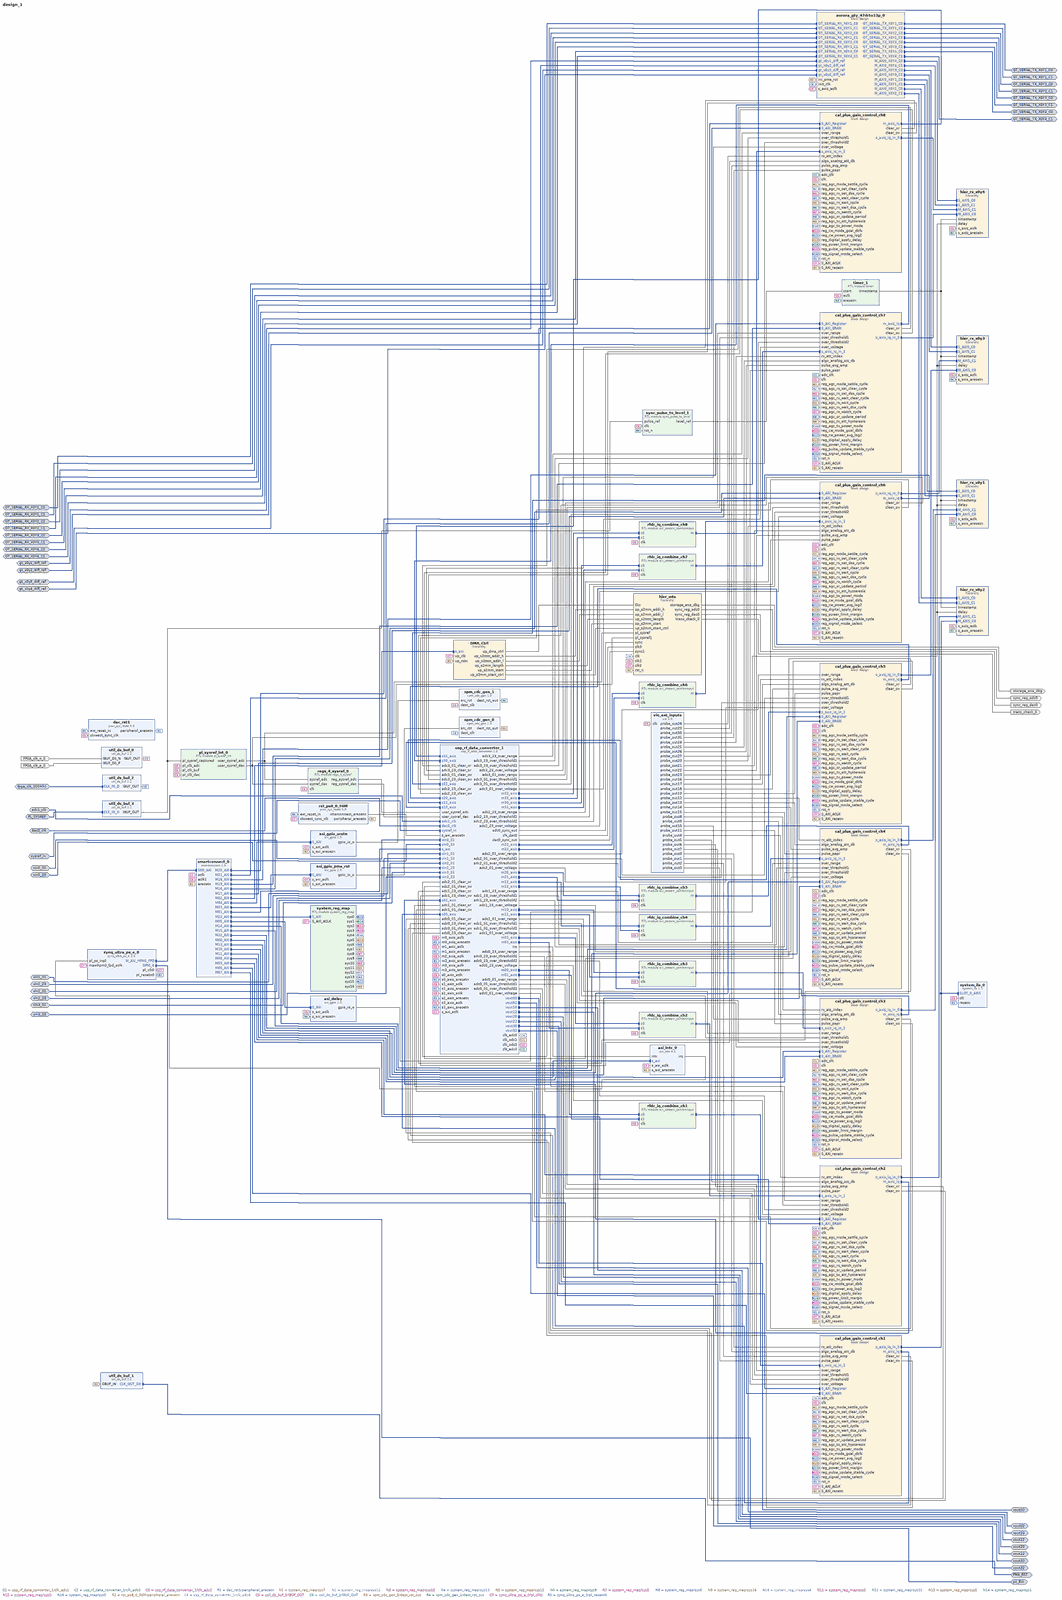
[diagram p0: block diagram of the top level, whole]
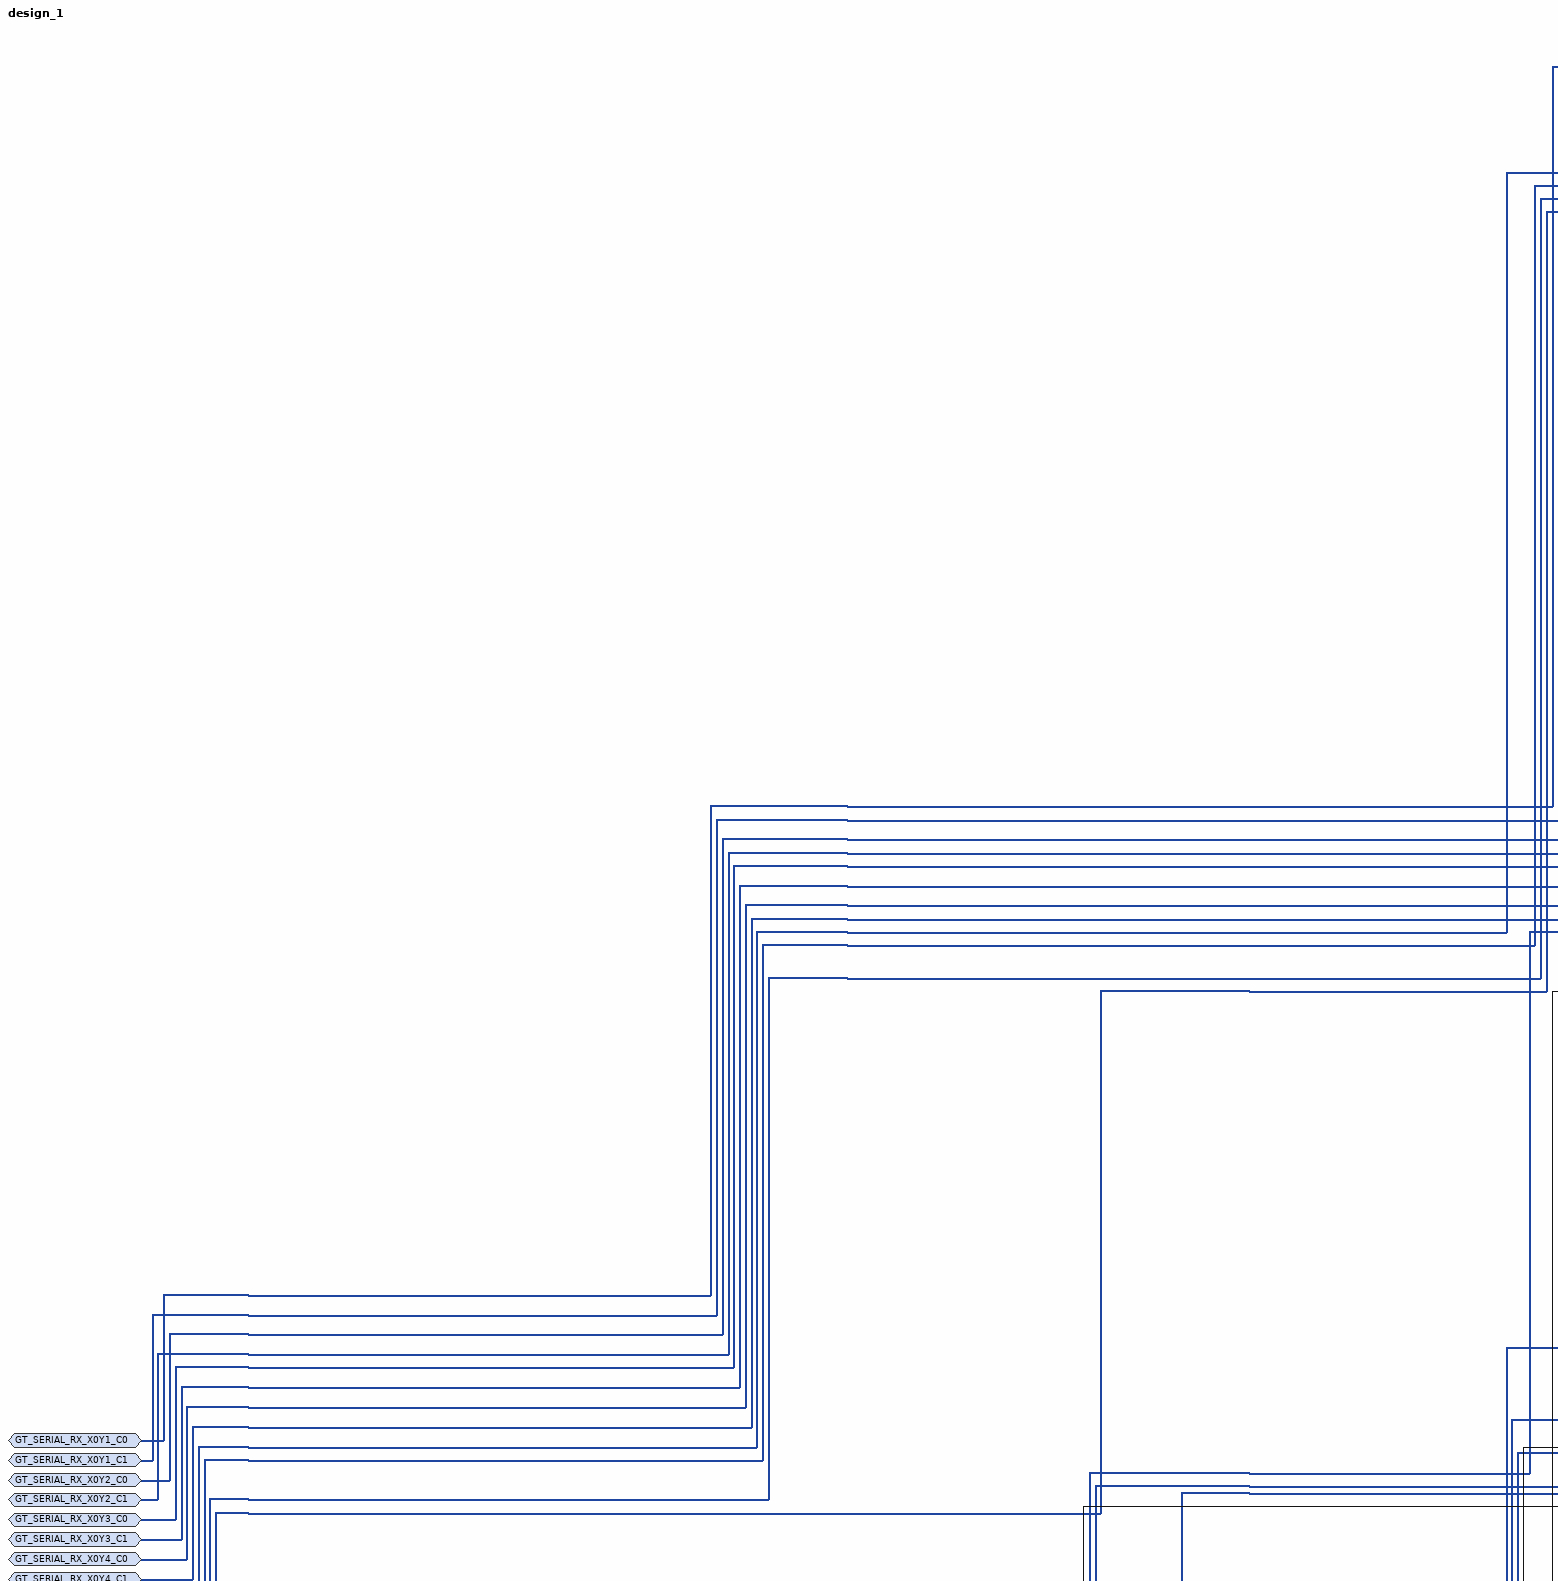
[diagram p1: block diagram of the top level, upper left part]
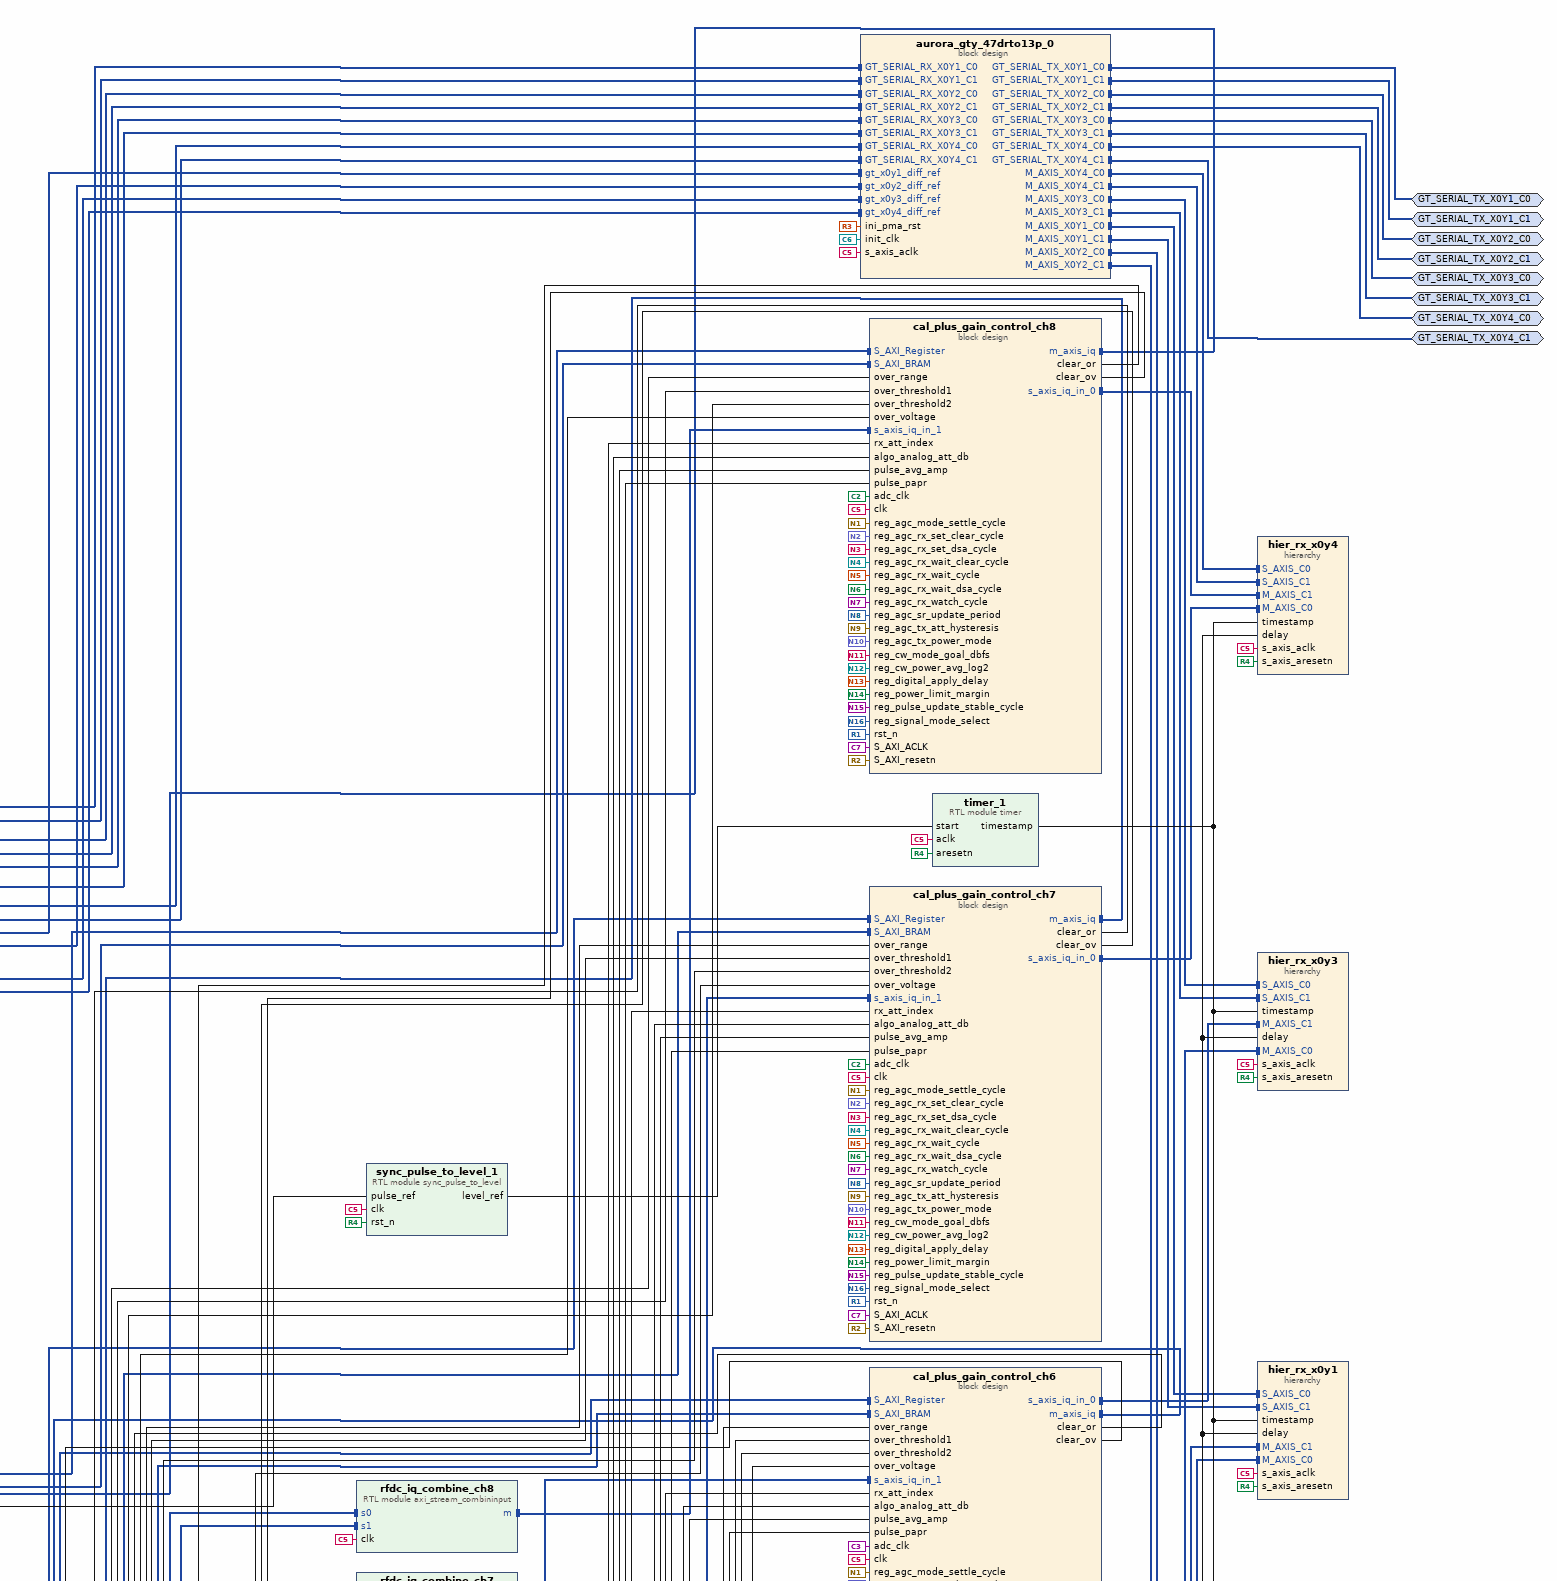
[diagram p2: block diagram of the top level, upper right part]
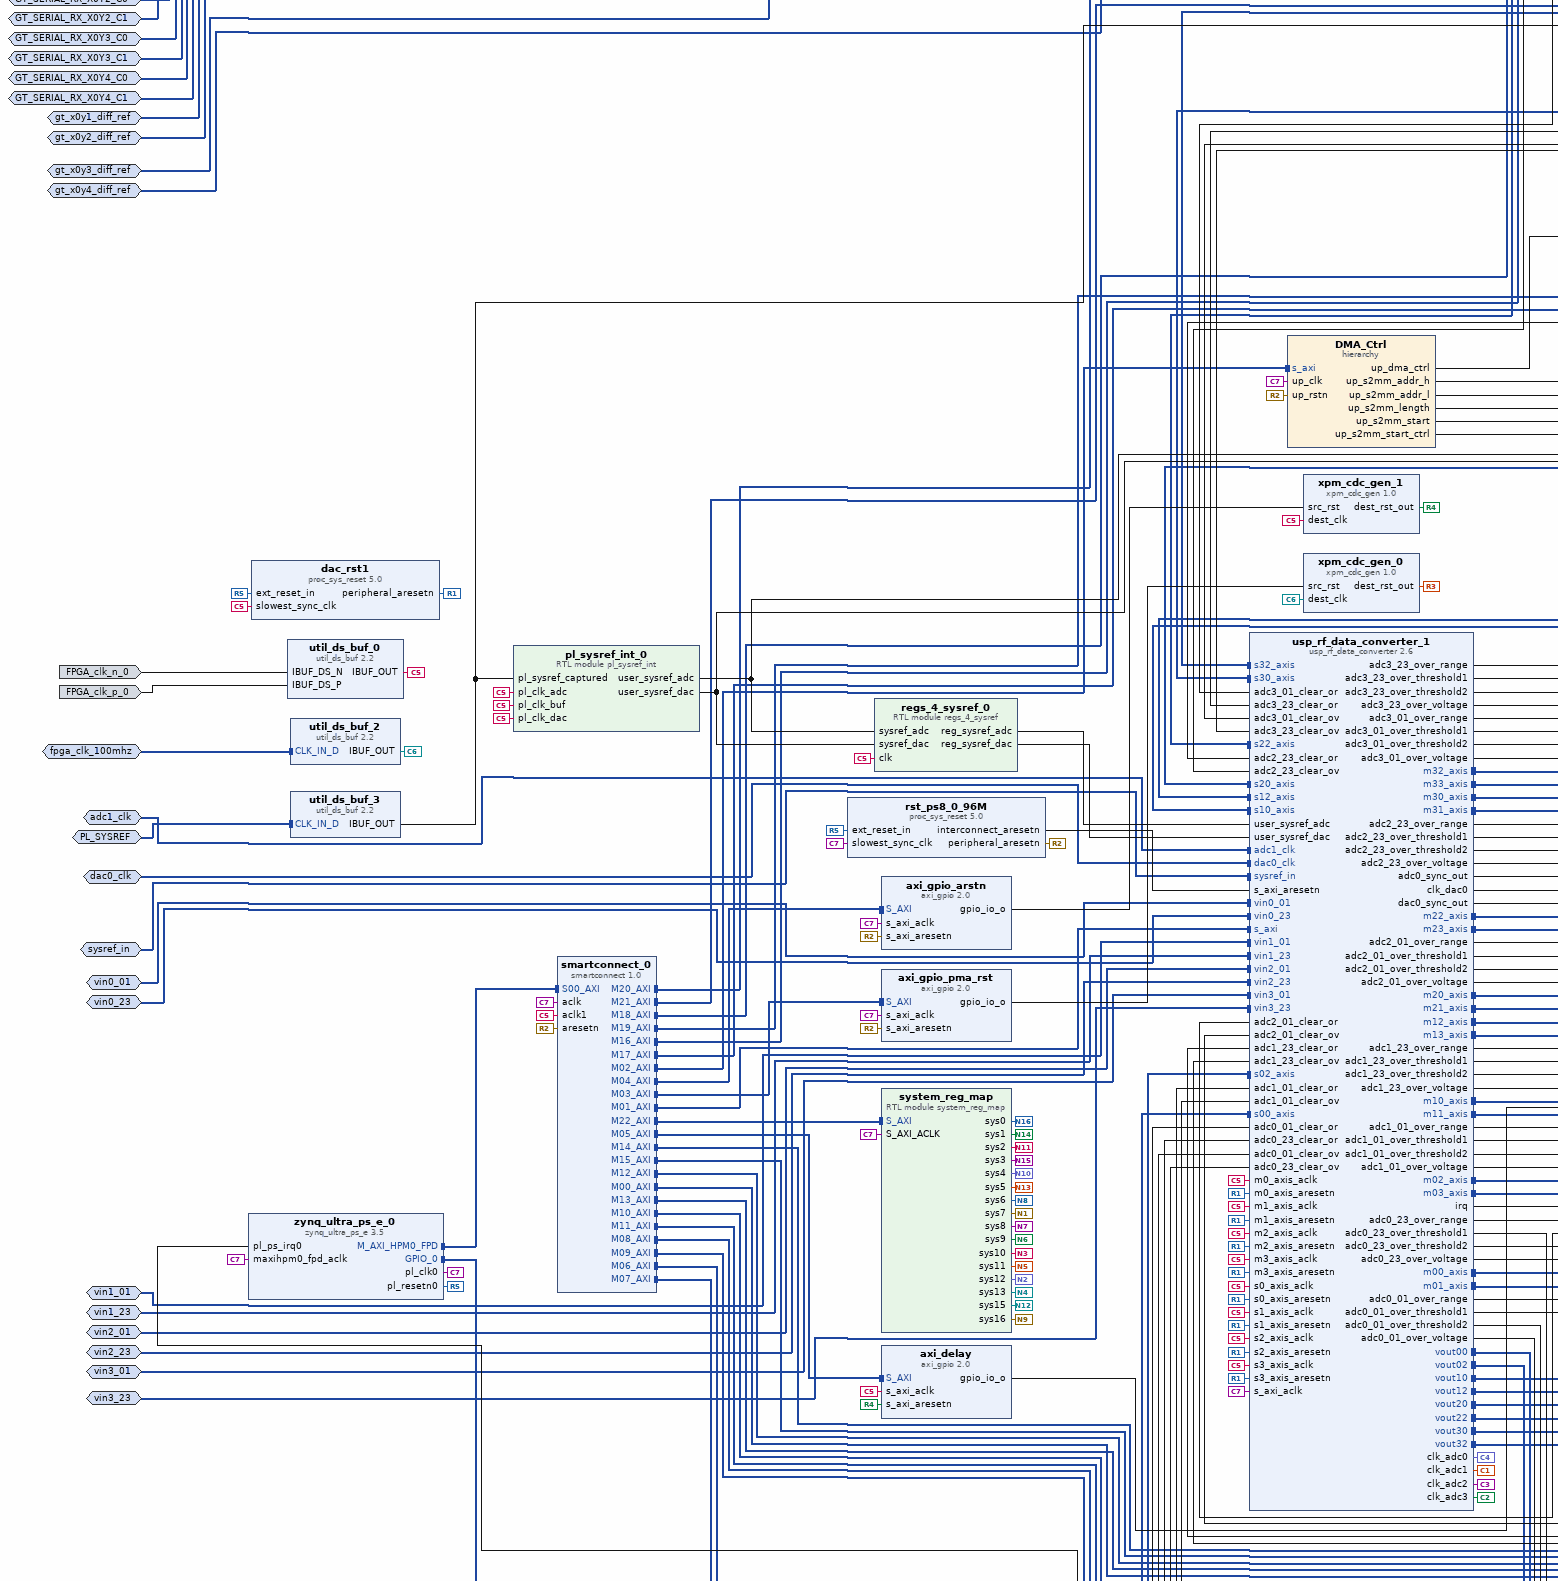
[diagram p3: block diagram of the top level, middle left part]
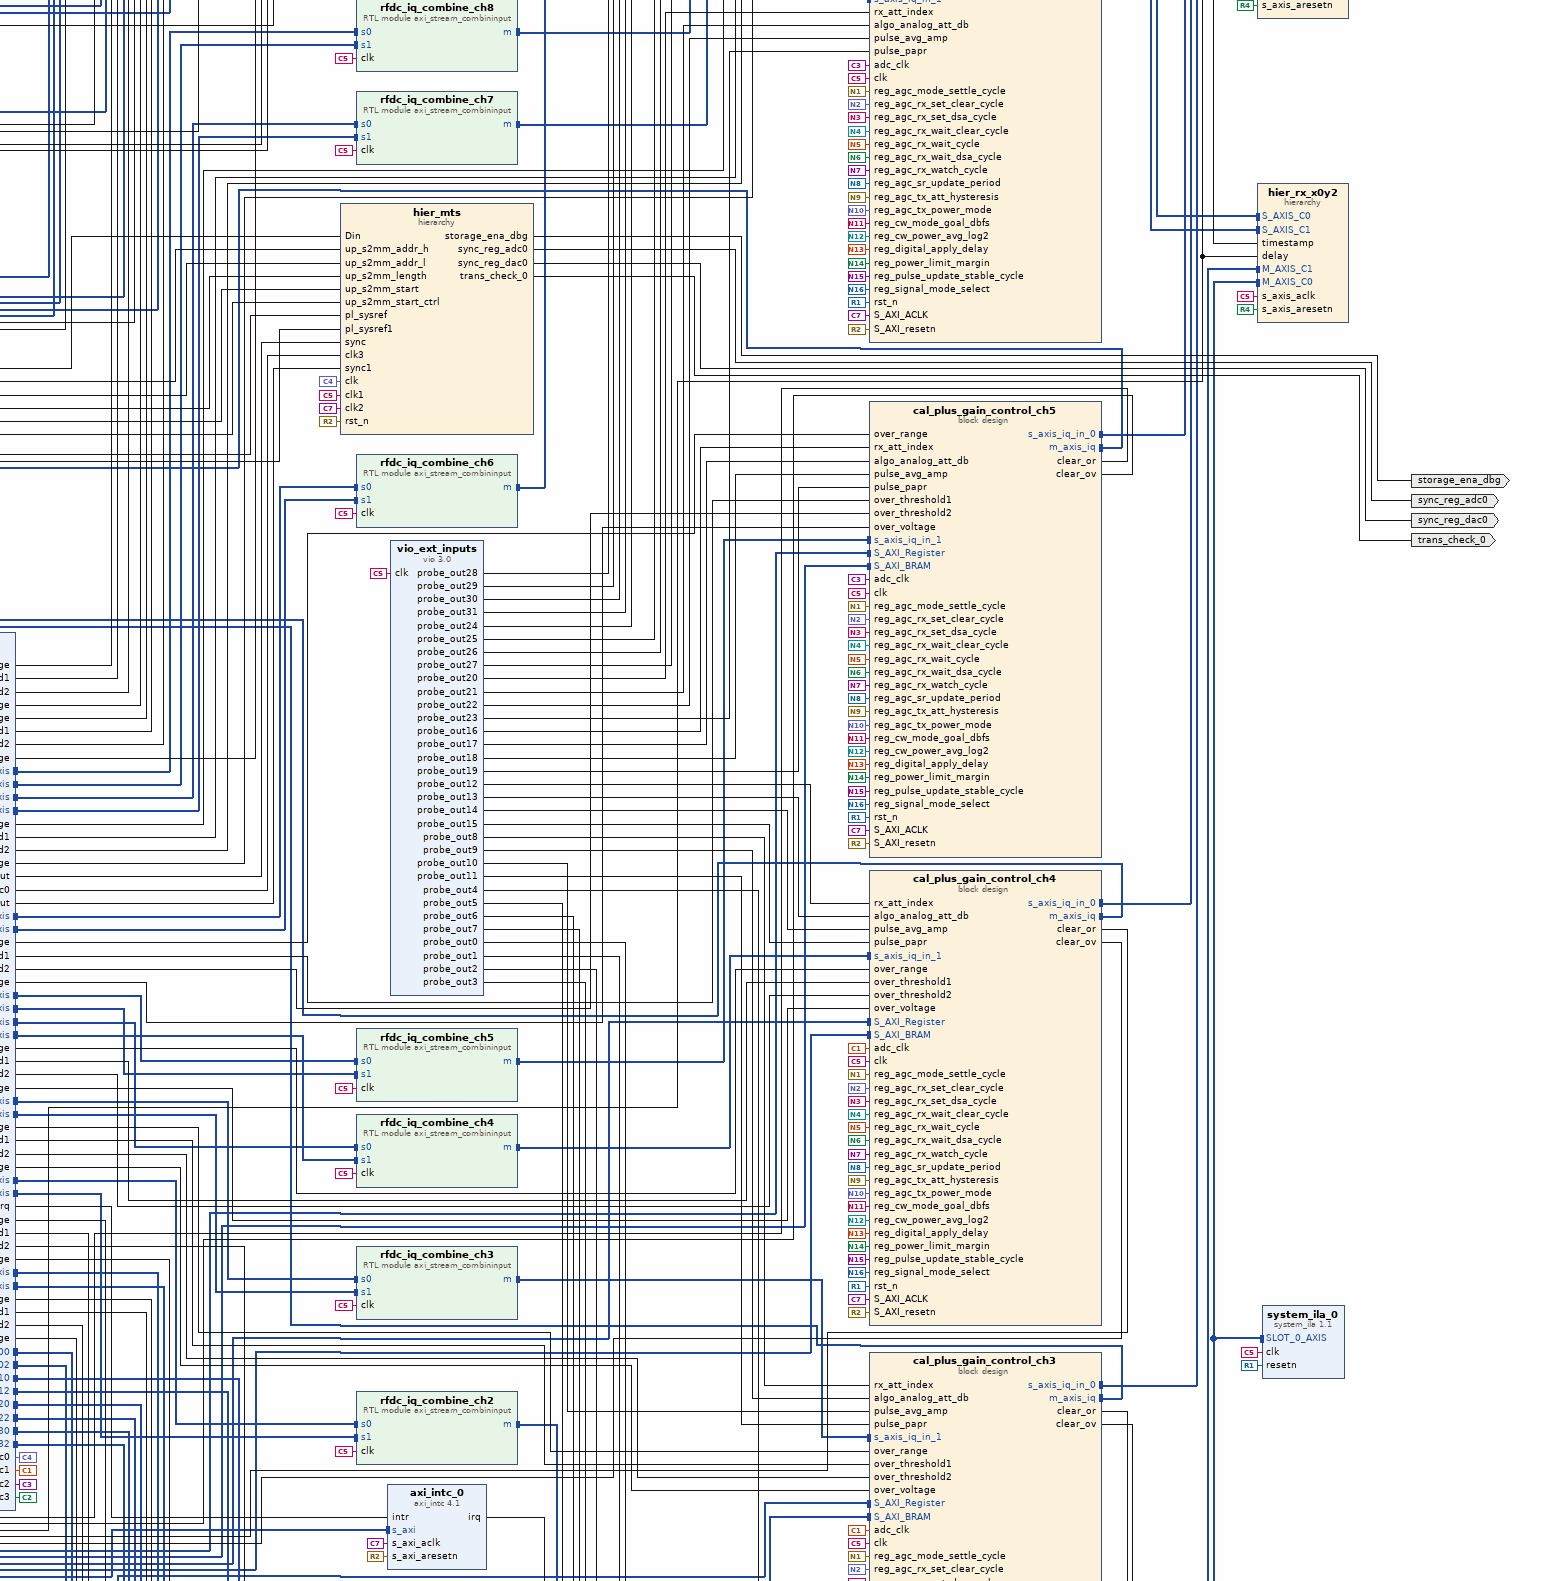
[diagram p4: block diagram of the top level, middle right part]
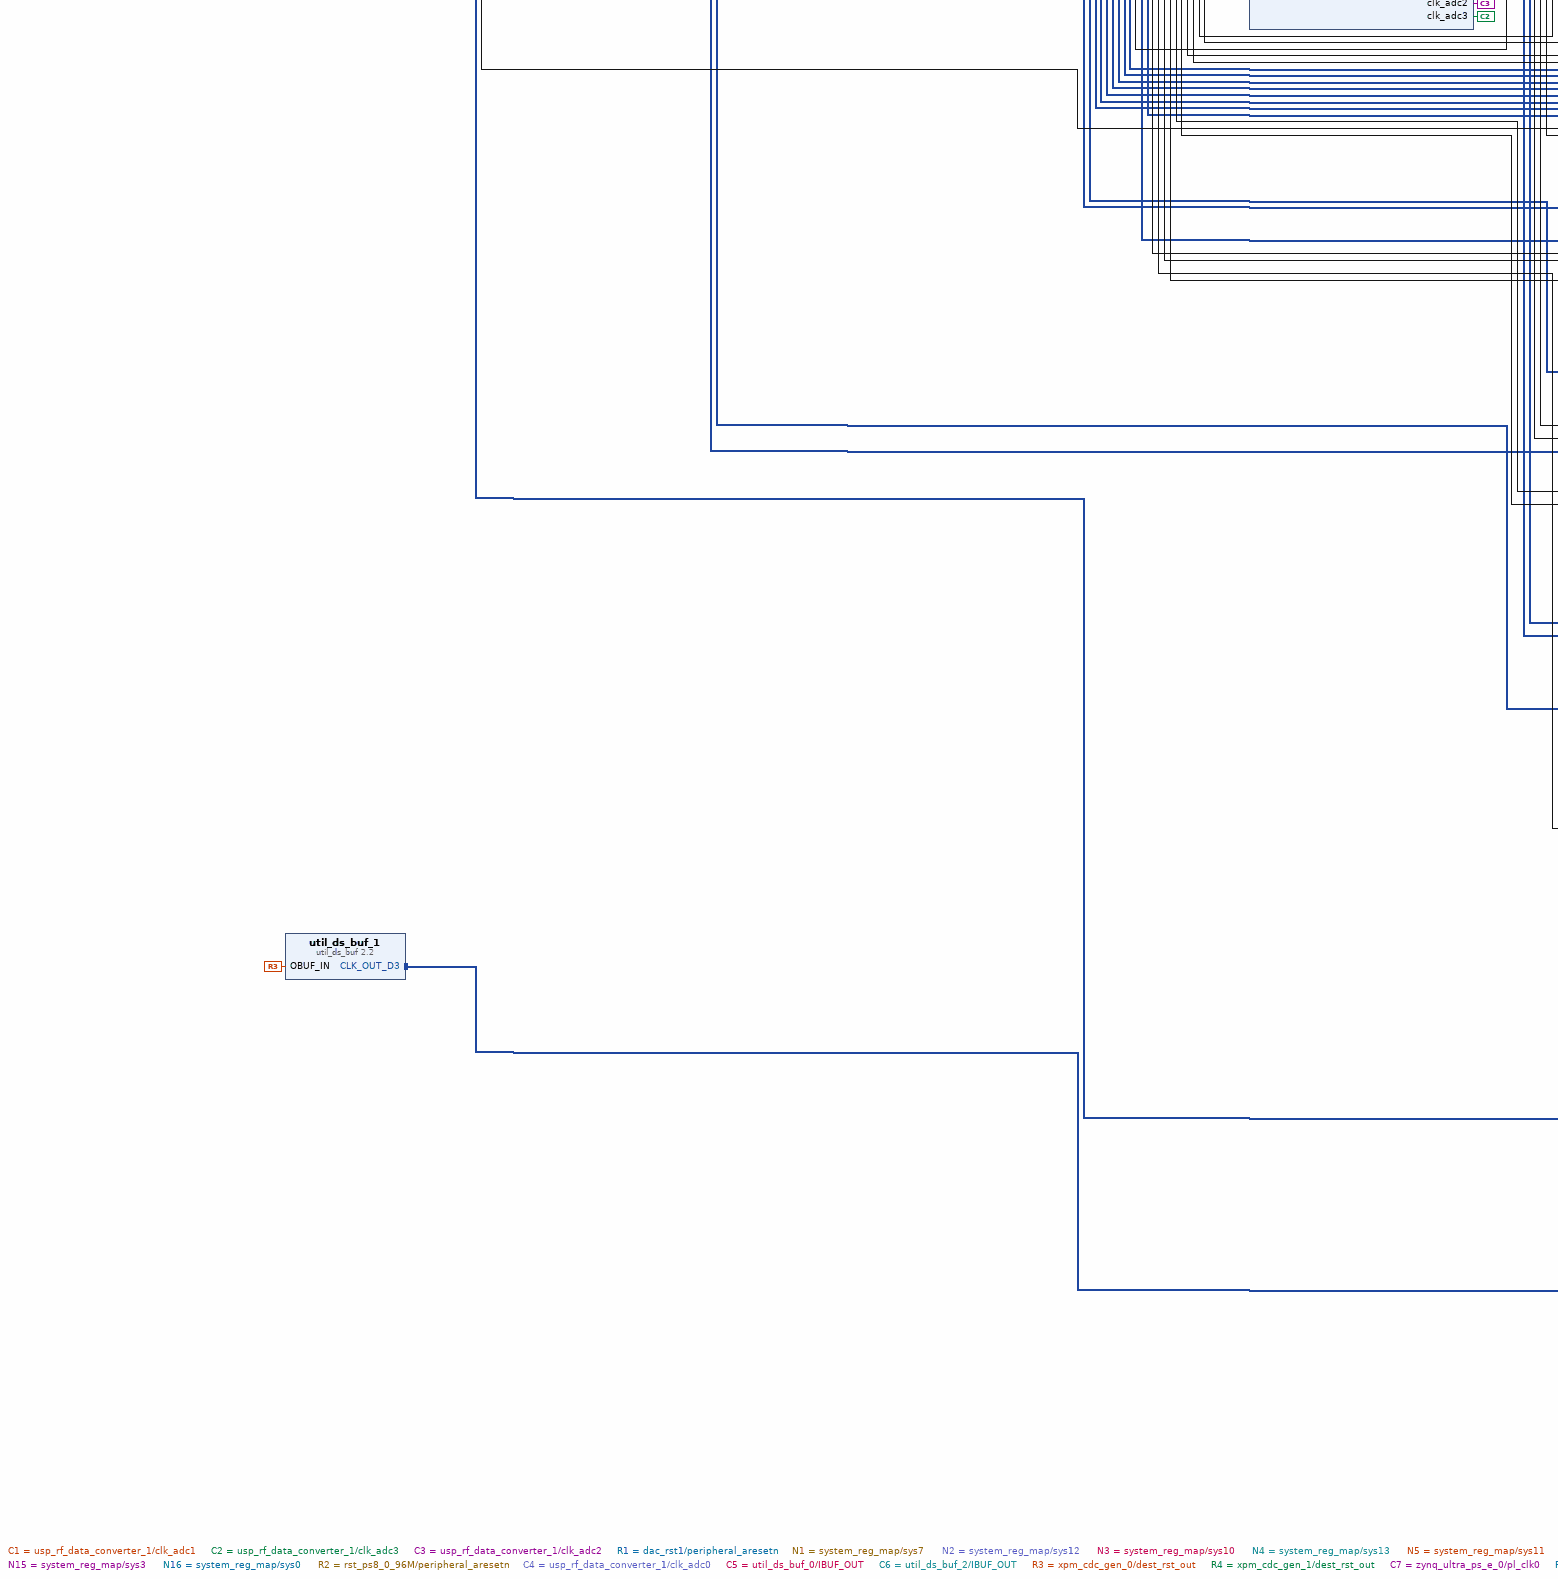
[diagram p5: block diagram of the top level, lower left part]
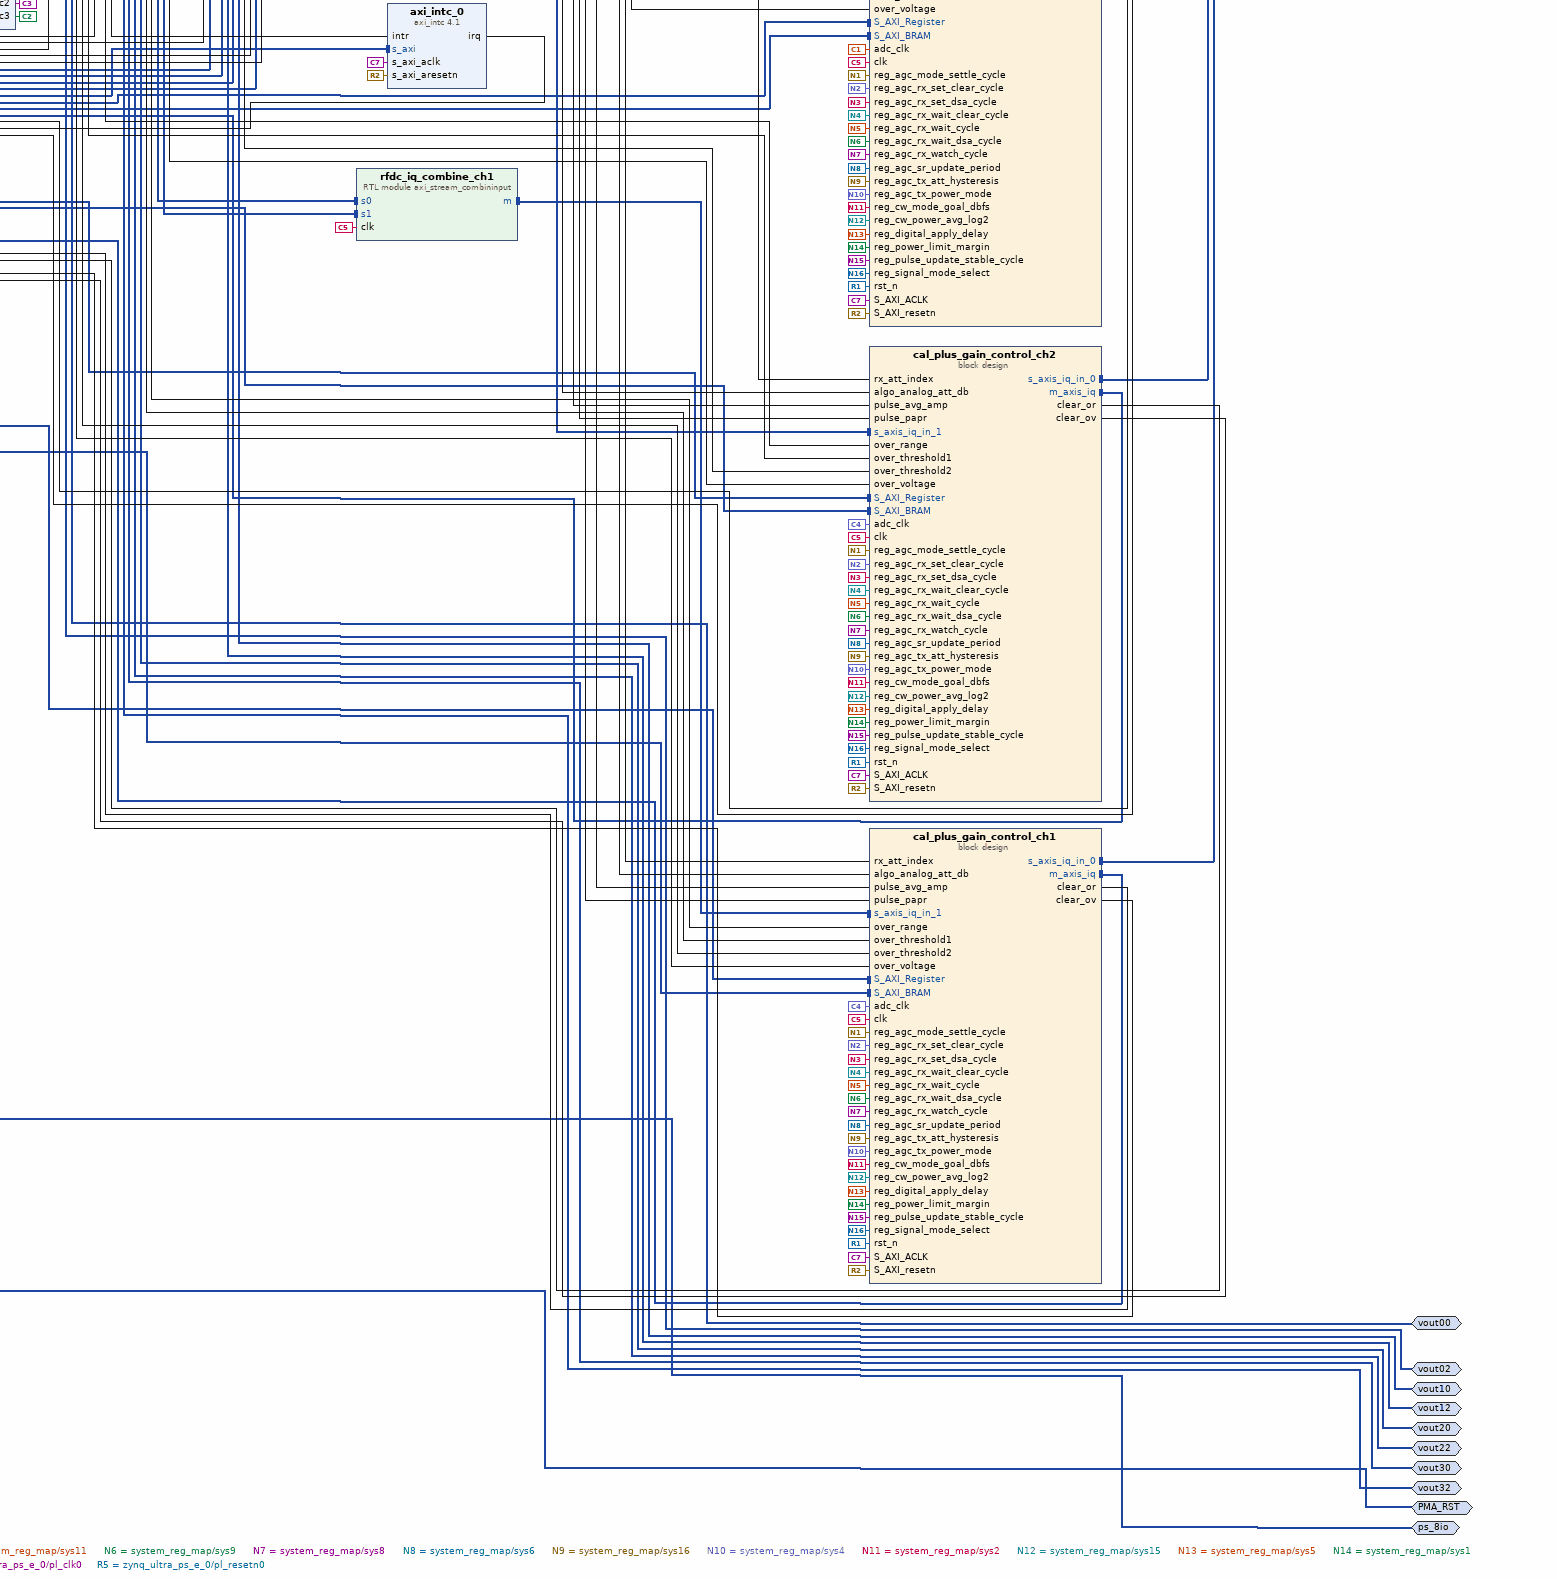
[diagram p6: block diagram of the top level, lower right part]
# Vivado block design design_1, xczu47dr-ffvg1517-2-i, Vivado 2025.2
create_bd_design design_1

create_bd_intf_port -mode Slave -vlnv xilinx.com:interface:diff_analog_io_rtl:1.0 vin0_01
create_bd_intf_port -mode Slave -vlnv xilinx.com:interface:diff_clock_rtl:1.0 dac0_clk
set_property -dict {CONFIG.FREQ_HZ 125000000} [get_bd_intf_ports dac0_clk]
create_bd_intf_port -mode Master -vlnv xilinx.com:interface:diff_analog_io_rtl:1.0 vout00
create_bd_intf_port -mode Master -vlnv xilinx.com:interface:diff_analog_io_rtl:1.0 vout02
create_bd_intf_port -mode Slave -vlnv xilinx.com:display_usp_rf_data_converter:diff_pins_rtl:1.0 sysref_in
create_bd_intf_port -mode Slave -vlnv xilinx.com:interface:diff_analog_io_rtl:1.0 vin0_23
create_bd_intf_port -mode Slave -vlnv xilinx.com:interface:diff_clock_rtl:1.0 adc1_clk
set_property -dict {CONFIG.FREQ_HZ 125000000} [get_bd_intf_ports adc1_clk]
create_bd_intf_port -mode Slave -vlnv xilinx.com:interface:diff_analog_io_rtl:1.0 vin1_01
create_bd_intf_port -mode Slave -vlnv xilinx.com:interface:diff_analog_io_rtl:1.0 vin1_23
create_bd_intf_port -mode Slave -vlnv xilinx.com:interface:diff_analog_io_rtl:1.0 vin2_01
create_bd_intf_port -mode Slave -vlnv xilinx.com:interface:diff_analog_io_rtl:1.0 vin2_23
create_bd_intf_port -mode Master -vlnv xilinx.com:interface:diff_analog_io_rtl:1.0 vout10
create_bd_intf_port -mode Master -vlnv xilinx.com:interface:diff_analog_io_rtl:1.0 vout12
create_bd_intf_port -mode Master -vlnv xilinx.com:interface:diff_analog_io_rtl:1.0 vout20
create_bd_intf_port -mode Master -vlnv xilinx.com:interface:diff_analog_io_rtl:1.0 vout22
create_bd_intf_port -mode Master -vlnv xilinx.com:interface:gpio_rtl:1.0 ps_8io
create_bd_intf_port -mode Slave -vlnv xilinx.com:display_aurora64b66b:GT_Serial_Transceiver_Pins_RX_rtl:1.0 GT_SERIAL_RX_X0Y1_C0
create_bd_intf_port -mode Slave -vlnv xilinx.com:display_aurora64b66b:GT_Serial_Transceiver_Pins_RX_rtl:1.0 GT_SERIAL_RX_X0Y2_C0
create_bd_intf_port -mode Slave -vlnv xilinx.com:display_aurora64b66b:GT_Serial_Transceiver_Pins_RX_rtl:1.0 GT_SERIAL_RX_X0Y1_C1
create_bd_intf_port -mode Slave -vlnv xilinx.com:display_aurora64b66b:GT_Serial_Transceiver_Pins_RX_rtl:1.0 GT_SERIAL_RX_X0Y2_C1
create_bd_intf_port -mode Master -vlnv xilinx.com:display_aurora64b66b:GT_Serial_Transceiver_Pins_TX_rtl:1.0 GT_SERIAL_TX_X0Y1_C1
create_bd_intf_port -mode Master -vlnv xilinx.com:display_aurora64b66b:GT_Serial_Transceiver_Pins_TX_rtl:1.0 GT_SERIAL_TX_X0Y2_C1
create_bd_intf_port -mode Master -vlnv xilinx.com:display_aurora64b66b:GT_Serial_Transceiver_Pins_TX_rtl:1.0 GT_SERIAL_TX_X0Y2_C0
create_bd_intf_port -mode Master -vlnv xilinx.com:display_aurora64b66b:GT_Serial_Transceiver_Pins_TX_rtl:1.0 GT_SERIAL_TX_X0Y1_C0
create_bd_intf_port -mode Slave -vlnv xilinx.com:interface:diff_clock_rtl:1.0 fpga_clk_100mhz
create_bd_intf_port -mode Slave -vlnv xilinx.com:interface:diff_clock_rtl:1.0 gt_x0y1_diff_ref
set_property -dict {CONFIG.FREQ_HZ 156250000} [get_bd_intf_ports gt_x0y1_diff_ref]
create_bd_intf_port -mode Slave -vlnv xilinx.com:interface:diff_clock_rtl:1.0 gt_x0y2_diff_ref
set_property -dict {CONFIG.FREQ_HZ 156250000} [get_bd_intf_ports gt_x0y2_diff_ref]
create_bd_intf_port -mode Slave -vlnv xilinx.com:interface:diff_clock_rtl:1.0 PL_SYSREF
create_bd_intf_port -mode Master -vlnv xilinx.com:interface:diff_analog_io_rtl:1.0 vout30
create_bd_intf_port -mode Master -vlnv xilinx.com:interface:diff_analog_io_rtl:1.0 vout32
create_bd_intf_port -mode Slave -vlnv xilinx.com:interface:diff_analog_io_rtl:1.0 vin3_01
create_bd_intf_port -mode Slave -vlnv xilinx.com:interface:diff_analog_io_rtl:1.0 vin3_23
create_bd_intf_port -mode Master -vlnv xilinx.com:interface:diff_clock_rtl:1.0 PMA_RST
create_bd_intf_port -mode Slave -vlnv xilinx.com:interface:diff_clock_rtl:1.0 gt_x0y3_diff_ref
set_property -dict {CONFIG.FREQ_HZ 156250000} [get_bd_intf_ports gt_x0y3_diff_ref]
create_bd_intf_port -mode Slave -vlnv xilinx.com:display_aurora64b66b:GT_Serial_Transceiver_Pins_RX_rtl:1.0 GT_SERIAL_RX_X0Y3_C0
create_bd_intf_port -mode Slave -vlnv xilinx.com:display_aurora64b66b:GT_Serial_Transceiver_Pins_RX_rtl:1.0 GT_SERIAL_RX_X0Y3_C1
create_bd_intf_port -mode Master -vlnv xilinx.com:display_aurora64b66b:GT_Serial_Transceiver_Pins_TX_rtl:1.0 GT_SERIAL_TX_X0Y3_C1
create_bd_intf_port -mode Master -vlnv xilinx.com:display_aurora64b66b:GT_Serial_Transceiver_Pins_TX_rtl:1.0 GT_SERIAL_TX_X0Y3_C0
create_bd_intf_port -mode Slave -vlnv xilinx.com:interface:diff_clock_rtl:1.0 gt_x0y4_diff_ref
set_property -dict {CONFIG.FREQ_HZ 156250000} [get_bd_intf_ports gt_x0y4_diff_ref]
create_bd_intf_port -mode Slave -vlnv xilinx.com:display_aurora64b66b:GT_Serial_Transceiver_Pins_RX_rtl:1.0 GT_SERIAL_RX_X0Y4_C0
create_bd_intf_port -mode Slave -vlnv xilinx.com:display_aurora64b66b:GT_Serial_Transceiver_Pins_RX_rtl:1.0 GT_SERIAL_RX_X0Y4_C1
create_bd_intf_port -mode Master -vlnv xilinx.com:display_aurora64b66b:GT_Serial_Transceiver_Pins_TX_rtl:1.0 GT_SERIAL_TX_X0Y4_C1
create_bd_intf_port -mode Master -vlnv xilinx.com:display_aurora64b66b:GT_Serial_Transceiver_Pins_TX_rtl:1.0 GT_SERIAL_TX_X0Y4_C0
create_bd_port -dir I -type clk FPGA_clk_n_0
set_property -dict {CONFIG.FREQ_HZ 256000000} [get_bd_ports FPGA_clk_n_0]
create_bd_port -dir I -type clk FPGA_clk_p_0
set_property -dict {CONFIG.FREQ_HZ 256000000} [get_bd_ports FPGA_clk_p_0]
create_bd_port -dir O trans_check_0
create_bd_port -dir O storage_ena_dbg
create_bd_port -dir O sync_reg_dac0
create_bd_port -dir O sync_reg_adc0

create_bd_cell -type ip -vlnv xilinx.com:ip:proc_sys_reset:5.0 rst_ps8_0_96M
create_bd_cell -type ip -vlnv xilinx.com:ip:usp_rf_data_converter:2.6 usp_rf_data_converter_1
set_property -dict [list \
  CONFIG.ADC0_Clock_Source 1 \
  CONFIG.ADC0_Multi_Tile_Sync true \
  CONFIG.ADC0_Outclk_Freq 240.000 \
  CONFIG.ADC0_PLL_Enable false \
  CONFIG.ADC0_Refclk_Freq 3840.000 \
  CONFIG.ADC0_Sampling_Rate 3.84 \
  CONFIG.ADC1_Clock_Dist 2 \
  CONFIG.ADC1_Clock_Source 1 \
  CONFIG.ADC1_Multi_Tile_Sync true \
  CONFIG.ADC1_Outclk_Freq 240.000 \
  CONFIG.ADC1_PLL_Enable true \
  CONFIG.ADC1_Refclk_Freq 256.000 \
  CONFIG.ADC1_Sampling_Rate 3.84 \
  CONFIG.ADC2_Clock_Source 1 \
  CONFIG.ADC2_Multi_Tile_Sync true \
  CONFIG.ADC2_Outclk_Freq 240.000 \
  CONFIG.ADC2_PLL_Enable false \
  CONFIG.ADC2_Refclk_Freq 3840.000 \
  CONFIG.ADC2_Sampling_Rate 3.84 \
  CONFIG.ADC3_Clock_Source 1 \
  CONFIG.ADC3_Multi_Tile_Sync true \
  CONFIG.ADC3_Outclk_Freq 240.000 \
  CONFIG.ADC3_Refclk_Freq 3840.000 \
  CONFIG.ADC3_Sampling_Rate 3.84 \
  CONFIG.ADC_DSA_RTS false \
  CONFIG.ADC_Data_Type00 1 \
  CONFIG.ADC_Data_Type02 1 \
  CONFIG.ADC_Data_Type10 1 \
  CONFIG.ADC_Data_Type12 1 \
  CONFIG.ADC_Data_Type20 1 \
  CONFIG.ADC_Data_Type22 1 \
  CONFIG.ADC_Data_Type30 1 \
  CONFIG.ADC_Data_Type32 1 \
  CONFIG.ADC_Data_Width00 5 \
  CONFIG.ADC_Data_Width02 5 \
  CONFIG.ADC_Data_Width10 5 \
  CONFIG.ADC_Data_Width12 5 \
  CONFIG.ADC_Data_Width20 5 \
  CONFIG.ADC_Data_Width22 5 \
  CONFIG.ADC_Data_Width30 5 \
  CONFIG.ADC_Data_Width32 5 \
  CONFIG.ADC_Decimation_Mode00 3 \
  CONFIG.ADC_Decimation_Mode02 3 \
  CONFIG.ADC_Decimation_Mode10 3 \
  CONFIG.ADC_Decimation_Mode12 3 \
  CONFIG.ADC_Decimation_Mode20 3 \
  CONFIG.ADC_Decimation_Mode22 3 \
  CONFIG.ADC_Decimation_Mode30 3 \
  CONFIG.ADC_Decimation_Mode32 3 \
  CONFIG.ADC_Dither00 false \
  CONFIG.ADC_Dither02 false \
  CONFIG.ADC_Dither10 false \
  CONFIG.ADC_Dither12 false \
  CONFIG.ADC_Dither20 false \
  CONFIG.ADC_Dither22 false \
  CONFIG.ADC_Dither30 false \
  CONFIG.ADC_Dither32 false \
  CONFIG.ADC_Mixer_Mode00 0 \
  CONFIG.ADC_Mixer_Mode02 0 \
  CONFIG.ADC_Mixer_Mode10 0 \
  CONFIG.ADC_Mixer_Mode12 0 \
  CONFIG.ADC_Mixer_Mode20 0 \
  CONFIG.ADC_Mixer_Mode22 0 \
  CONFIG.ADC_Mixer_Mode30 0 \
  CONFIG.ADC_Mixer_Mode32 0 \
  CONFIG.ADC_Mixer_Type00 2 \
  CONFIG.ADC_Mixer_Type02 2 \
  CONFIG.ADC_Mixer_Type10 2 \
  CONFIG.ADC_Mixer_Type12 2 \
  CONFIG.ADC_Mixer_Type20 2 \
  CONFIG.ADC_Mixer_Type22 2 \
  CONFIG.ADC_Mixer_Type30 2 \
  CONFIG.ADC_Mixer_Type32 2 \
  CONFIG.ADC_NCO_Freq00 1.04 \
  CONFIG.ADC_NCO_Freq02 1.04 \
  CONFIG.ADC_NCO_Freq10 1.04 \
  CONFIG.ADC_NCO_Freq12 1.04 \
  CONFIG.ADC_NCO_Freq20 1.04 \
  CONFIG.ADC_NCO_Freq22 1.04 \
  CONFIG.ADC_NCO_Freq30 1.04 \
  CONFIG.ADC_NCO_Freq32 1.04 \
  CONFIG.ADC_NCO_RTS false \
  CONFIG.ADC_Nyquist00 1 \
  CONFIG.ADC_Nyquist02 1 \
  CONFIG.ADC_Nyquist10 1 \
  CONFIG.ADC_Nyquist12 1 \
  CONFIG.ADC_Nyquist20 1 \
  CONFIG.ADC_Nyquist22 1 \
  CONFIG.ADC_Nyquist30 1 \
  CONFIG.ADC_Nyquist32 1 \
  CONFIG.ADC_OBS12 false \
  CONFIG.ADC_OBS22 false \
  CONFIG.ADC_RTS true \
  CONFIG.ADC_Slice02_Enable true \
  CONFIG.ADC_Slice10_Enable true \
  CONFIG.ADC_Slice12_Enable true \
  CONFIG.ADC_Slice20_Enable true \
  CONFIG.ADC_Slice22_Enable true \
  CONFIG.ADC_Slice30_Enable true \
  CONFIG.ADC_Slice32_Enable true \
  CONFIG.DAC0_Clock_Dist 1 \
  CONFIG.DAC0_Multi_Tile_Sync true \
  CONFIG.DAC0_Outclk_Freq 240.000 \
  CONFIG.DAC0_PLL_Enable true \
  CONFIG.DAC0_Refclk_Freq 256.000 \
  CONFIG.DAC0_Sampling_Rate 3.84 \
  CONFIG.DAC0_VOP 32 \
  CONFIG.DAC1_Clock_Source 4 \
  CONFIG.DAC1_Multi_Tile_Sync true \
  CONFIG.DAC1_Outclk_Freq 240.000 \
  CONFIG.DAC1_PLL_Enable true \
  CONFIG.DAC1_Refclk_Freq 256.000 \
  CONFIG.DAC1_Sampling_Rate 3.84 \
  CONFIG.DAC1_VOP 32 \
  CONFIG.DAC2_Clock_Dist 0 \
  CONFIG.DAC2_Clock_Source 4 \
  CONFIG.DAC2_Multi_Tile_Sync true \
  CONFIG.DAC2_Outclk_Freq 240.000 \
  CONFIG.DAC2_PLL_Enable true \
  CONFIG.DAC2_Refclk_Freq 256.000 \
  CONFIG.DAC2_Sampling_Rate 3.84 \
  CONFIG.DAC2_VOP 32 \
  CONFIG.DAC3_Clock_Source 4 \
  CONFIG.DAC3_Multi_Tile_Sync true \
  CONFIG.DAC3_Outclk_Freq 240.000 \
  CONFIG.DAC3_PLL_Enable true \
  CONFIG.DAC3_Refclk_Freq 256.000 \
  CONFIG.DAC3_Sampling_Rate 3.84 \
  CONFIG.DAC3_VOP 32 \
  CONFIG.DAC_Data_Type10 0 \
  CONFIG.DAC_Data_Type12 0 \
  CONFIG.DAC_Data_Width00 10 \
  CONFIG.DAC_Data_Width02 10 \
  CONFIG.DAC_Data_Width10 10 \
  CONFIG.DAC_Data_Width12 10 \
  CONFIG.DAC_Data_Width20 10 \
  CONFIG.DAC_Data_Width22 10 \
  CONFIG.DAC_Data_Width30 10 \
  CONFIG.DAC_Data_Width32 10 \
  CONFIG.DAC_Debug true \
  CONFIG.DAC_Decoder_Mode00 0 \
  CONFIG.DAC_Decoder_Mode02 0 \
  CONFIG.DAC_Decoder_Mode10 0 \
  CONFIG.DAC_Decoder_Mode12 0 \
  CONFIG.DAC_Decoder_Mode20 0 \
  CONFIG.DAC_Decoder_Mode22 0 \
  CONFIG.DAC_Decoder_Mode30 0 \
  CONFIG.DAC_Decoder_Mode32 0 \
  CONFIG.DAC_Interpolation_Mode00 3 \
  CONFIG.DAC_Interpolation_Mode02 3 \
  CONFIG.DAC_Interpolation_Mode10 3 \
  CONFIG.DAC_Interpolation_Mode12 3 \
  CONFIG.DAC_Interpolation_Mode20 3 \
  CONFIG.DAC_Interpolation_Mode22 3 \
  CONFIG.DAC_Interpolation_Mode30 3 \
  CONFIG.DAC_Interpolation_Mode32 3 \
  CONFIG.DAC_Invsinc_Ctrl00 true \
  CONFIG.DAC_Invsinc_Ctrl02 true \
  CONFIG.DAC_Invsinc_Ctrl10 true \
  CONFIG.DAC_Invsinc_Ctrl12 true \
  CONFIG.DAC_Invsinc_Ctrl20 true \
  CONFIG.DAC_Invsinc_Ctrl22 true \
  CONFIG.DAC_Invsinc_Ctrl30 true \
  CONFIG.DAC_Invsinc_Ctrl32 true \
  CONFIG.DAC_Mixer_Mode00 0 \
  CONFIG.DAC_Mixer_Mode02 0 \
  CONFIG.DAC_Mixer_Mode10 0 \
  CONFIG.DAC_Mixer_Mode12 0 \
  CONFIG.DAC_Mixer_Mode20 0 \
  CONFIG.DAC_Mixer_Mode22 0 \
  CONFIG.DAC_Mixer_Mode30 0 \
  CONFIG.DAC_Mixer_Mode32 0 \
  CONFIG.DAC_Mixer_Type00 2 \
  CONFIG.DAC_Mixer_Type02 2 \
  CONFIG.DAC_Mixer_Type10 2 \
  CONFIG.DAC_Mixer_Type12 2 \
  CONFIG.DAC_Mixer_Type20 2 \
  CONFIG.DAC_Mixer_Type22 2 \
  CONFIG.DAC_Mixer_Type30 2 \
  CONFIG.DAC_Mixer_Type32 2 \
  CONFIG.DAC_Mode00 0 \
  CONFIG.DAC_Mode02 0 \
  CONFIG.DAC_Mode10 0 \
  CONFIG.DAC_Mode12 0 \
  CONFIG.DAC_Mode20 0 \
  CONFIG.DAC_Mode22 0 \
  CONFIG.DAC_Mode30 0 \
  CONFIG.DAC_Mode32 0 \
  CONFIG.DAC_NCO_Freq00 -1.04 \
  CONFIG.DAC_NCO_Freq02 -1.04 \
  CONFIG.DAC_NCO_Freq10 -1.04 \
  CONFIG.DAC_NCO_Freq12 -1.04 \
  CONFIG.DAC_NCO_Freq20 -1.04 \
  CONFIG.DAC_NCO_Freq22 -1.04 \
  CONFIG.DAC_NCO_Freq30 -1.04 \
  CONFIG.DAC_NCO_Freq32 -1.04 \
  CONFIG.DAC_NCO_RTS false \
  CONFIG.DAC_Nyquist00 1 \
  CONFIG.DAC_Nyquist02 1 \
  CONFIG.DAC_Nyquist10 1 \
  CONFIG.DAC_Nyquist12 1 \
  CONFIG.DAC_Nyquist20 1 \
  CONFIG.DAC_Nyquist22 1 \
  CONFIG.DAC_Nyquist30 1 \
  CONFIG.DAC_Nyquist32 1 \
  CONFIG.DAC_RTS true \
  CONFIG.DAC_Slice00_Enable true \
  CONFIG.DAC_Slice02_Enable true \
  CONFIG.DAC_Slice10_Enable true \
  CONFIG.DAC_Slice12_Enable true \
  CONFIG.DAC_Slice20_Enable true \
  CONFIG.DAC_Slice22_Enable true \
  CONFIG.DAC_Slice30_Enable true \
  CONFIG.DAC_Slice32_Enable true \
] [get_bd_cells usp_rf_data_converter_1]
create_bd_cell -type ip -vlnv xilinx.com:ip:zynq_ultra_ps_e:3.5 zynq_ultra_ps_e_0
set_property -dict [list \
  CONFIG.CAN0_BOARD_INTERFACE custom \
  CONFIG.CAN1_BOARD_INTERFACE custom \
  CONFIG.CSU_BOARD_INTERFACE custom \
  CONFIG.DP_BOARD_INTERFACE custom \
  CONFIG.GEM0_BOARD_INTERFACE custom \
  CONFIG.GEM1_BOARD_INTERFACE custom \
  CONFIG.GEM2_BOARD_INTERFACE custom \
  CONFIG.GEM3_BOARD_INTERFACE custom \
  CONFIG.GPIO_BOARD_INTERFACE custom \
  CONFIG.IIC0_BOARD_INTERFACE custom \
  CONFIG.IIC1_BOARD_INTERFACE custom \
  CONFIG.NAND_BOARD_INTERFACE custom \
  CONFIG.PCIE_BOARD_INTERFACE custom \
  CONFIG.PJTAG_BOARD_INTERFACE custom \
  CONFIG.PMU_BOARD_INTERFACE custom \
  CONFIG.PSU_BANK_0_IO_STANDARD LVCMOS18 \
  CONFIG.PSU_BANK_1_IO_STANDARD LVCMOS18 \
  CONFIG.PSU_BANK_2_IO_STANDARD LVCMOS18 \
  CONFIG.PSU_BANK_3_IO_STANDARD LVCMOS18 \
  CONFIG.PSU_USB3__DUAL_CLOCK_ENABLE 0 \
  CONFIG.PSU__CAN1__PERIPHERAL__ENABLE 0 \
  CONFIG.PSU__CRF_APB__ACPU_CTRL__FREQMHZ 1300 \
  CONFIG.PSU__CRF_APB__ACPU_CTRL__SRCSEL APLL \
  CONFIG.PSU__CRF_APB__APLL_CTRL__SRCSEL PSS_REF_CLK \
  CONFIG.PSU__CRF_APB__DBG_FPD_CTRL__FREQMHZ 250 \
  CONFIG.PSU__CRF_APB__DBG_FPD_CTRL__SRCSEL IOPLL \
  CONFIG.PSU__CRF_APB__DBG_TRACE_CTRL__FREQMHZ 125 \
  CONFIG.PSU__CRF_APB__DBG_TRACE_CTRL__SRCSEL IOPLL \
  CONFIG.PSU__CRF_APB__DBG_TSTMP_CTRL__FREQMHZ 250 \
  CONFIG.PSU__CRF_APB__DBG_TSTMP_CTRL__SRCSEL IOPLL \
  CONFIG.PSU__CRF_APB__DDR_CTRL__FREQMHZ 1200 \
  CONFIG.PSU__CRF_APB__DDR_CTRL__SRCSEL DPLL \
  CONFIG.PSU__CRF_APB__DPDMA_REF_CTRL__FREQMHZ 600 \
  CONFIG.PSU__CRF_APB__DPDMA_REF_CTRL__SRCSEL DPLL \
  CONFIG.PSU__CRF_APB__DPLL_CTRL__SRCSEL PSS_REF_CLK \
  CONFIG.PSU__CRF_APB__DP_AUDIO_REF_CTRL__SRCSEL VPLL \
  CONFIG.PSU__CRF_APB__DP_STC_REF_CTRL__SRCSEL VPLL \
  CONFIG.PSU__CRF_APB__DP_VIDEO_REF_CTRL__FREQMHZ 320 \
  CONFIG.PSU__CRF_APB__DP_VIDEO_REF_CTRL__SRCSEL DPLL \
  CONFIG.PSU__CRF_APB__GDMA_REF_CTRL__FREQMHZ 600 \
  CONFIG.PSU__CRF_APB__GDMA_REF_CTRL__SRCSEL DPLL \
  CONFIG.PSU__CRF_APB__GPU_REF_CTRL__FREQMHZ 600 \
  CONFIG.PSU__CRF_APB__GPU_REF_CTRL__SRCSEL IOPLL \
  CONFIG.PSU__CRF_APB__TOPSW_LSBUS_CTRL__FREQMHZ 100 \
  CONFIG.PSU__CRF_APB__TOPSW_LSBUS_CTRL__SRCSEL IOPLL \
  CONFIG.PSU__CRF_APB__TOPSW_MAIN_CTRL__FREQMHZ 533.33 \
  CONFIG.PSU__CRF_APB__TOPSW_MAIN_CTRL__SRCSEL VPLL \
  CONFIG.PSU__CRF_APB__VPLL_CTRL__SRCSEL PSS_REF_CLK \
  CONFIG.PSU__CRL_APB__ADMA_REF_CTRL__FREQMHZ 534 \
  CONFIG.PSU__CRL_APB__ADMA_REF_CTRL__SRCSEL RPLL \
  CONFIG.PSU__CRL_APB__AMS_REF_CTRL__FREQMHZ 52 \
  CONFIG.PSU__CRL_APB__CAN1_REF_CTRL__FREQMHZ 100 \
  CONFIG.PSU__CRL_APB__CAN1_REF_CTRL__SRCSEL IOPLL \
  CONFIG.PSU__CRL_APB__CPU_R5_CTRL__FREQMHZ 534 \
  CONFIG.PSU__CRL_APB__CPU_R5_CTRL__SRCSEL RPLL \
  CONFIG.PSU__CRL_APB__DBG_LPD_CTRL__FREQMHZ 250 \
  CONFIG.PSU__CRL_APB__DBG_LPD_CTRL__SRCSEL IOPLL \
  CONFIG.PSU__CRL_APB__GEM3_REF_CTRL__FREQMHZ 125 \
  CONFIG.PSU__CRL_APB__GEM3_REF_CTRL__SRCSEL IOPLL \
  CONFIG.PSU__CRL_APB__I2C0_REF_CTRL__FREQMHZ 100 \
  CONFIG.PSU__CRL_APB__I2C0_REF_CTRL__SRCSEL IOPLL \
  CONFIG.PSU__CRL_APB__I2C1_REF_CTRL__FREQMHZ 100 \
  CONFIG.PSU__CRL_APB__I2C1_REF_CTRL__SRCSEL IOPLL \
  CONFIG.PSU__CRL_APB__IOPLL_CTRL__SRCSEL PSS_REF_CLK \
  CONFIG.PSU__CRL_APB__IOU_SWITCH_CTRL__FREQMHZ 267 \
  CONFIG.PSU__CRL_APB__IOU_SWITCH_CTRL__SRCSEL RPLL \
  CONFIG.PSU__CRL_APB__LPD_LSBUS_CTRL__FREQMHZ 100 \
  CONFIG.PSU__CRL_APB__LPD_LSBUS_CTRL__SRCSEL IOPLL \
  CONFIG.PSU__CRL_APB__LPD_SWITCH_CTRL__FREQMHZ 534 \
  CONFIG.PSU__CRL_APB__LPD_SWITCH_CTRL__SRCSEL RPLL \
  CONFIG.PSU__CRL_APB__PCAP_CTRL__FREQMHZ 167 \
  CONFIG.PSU__CRL_APB__PCAP_CTRL__SRCSEL IOPLL \
  CONFIG.PSU__CRL_APB__PL0_REF_CTRL__FREQMHZ 100 \
  CONFIG.PSU__CRL_APB__PL0_REF_CTRL__SRCSEL IOPLL \
  CONFIG.PSU__CRL_APB__QSPI_REF_CTRL__FREQMHZ 300 \
  CONFIG.PSU__CRL_APB__QSPI_REF_CTRL__SRCSEL IOPLL \
  CONFIG.PSU__CRL_APB__RPLL_CTRL__SRCSEL PSS_REF_CLK \
  CONFIG.PSU__CRL_APB__SDIO1_REF_CTRL__FREQMHZ 200 \
  CONFIG.PSU__CRL_APB__SDIO1_REF_CTRL__SRCSEL RPLL \
  CONFIG.PSU__CRL_APB__TIMESTAMP_REF_CTRL__FREQMHZ 100 \
  CONFIG.PSU__CRL_APB__TIMESTAMP_REF_CTRL__SRCSEL PSS_REF_CLK \
  CONFIG.PSU__CRL_APB__UART0_REF_CTRL__FREQMHZ 100 \
  CONFIG.PSU__CRL_APB__UART0_REF_CTRL__SRCSEL IOPLL \
  CONFIG.PSU__CRL_APB__UART1_REF_CTRL__FREQMHZ 100 \
  CONFIG.PSU__CRL_APB__UART1_REF_CTRL__SRCSEL IOPLL \
  CONFIG.PSU__CRL_APB__USB0_BUS_REF_CTRL__FREQMHZ 250 \
  CONFIG.PSU__CRL_APB__USB0_BUS_REF_CTRL__SRCSEL IOPLL \
  CONFIG.PSU__CRL_APB__USB3_DUAL_REF_CTRL__FREQMHZ 20 \
  CONFIG.PSU__CRL_APB__USB3_DUAL_REF_CTRL__SRCSEL IOPLL \
  CONFIG.PSU__CRL_APB__USB3__ENABLE 0 \
  CONFIG.PSU__CSUPMU__PERIPHERAL__VALID 0 \
  CONFIG.PSU__DDRC__BUS_WIDTH {64 Bit} \
  CONFIG.PSU__DDRC__COMPONENTS Components \
  CONFIG.PSU__DDRC__DEVICE_CAPACITY {16384 MBits} \
  CONFIG.PSU__DDRC__DRAM_WIDTH {16 Bits} \
  CONFIG.PSU__DDRC__ECC Disabled \
  CONFIG.PSU__DDRC__MEMORY_TYPE {DDR 4} \
  CONFIG.PSU__DDRC__SPEED_BIN DDR4_2400P \
  CONFIG.PSU__DDR_HIGH_ADDRESS_GUI_ENABLE 1 \
  CONFIG.PSU__DDR__INTERFACE__FREQMHZ 600.000 \
  CONFIG.PSU__DEVICE_TYPE RFSOC \
  CONFIG.PSU__DISPLAYPORT__PERIPHERAL__ENABLE 0 \
  CONFIG.PSU__DLL__ISUSED 1 \
  CONFIG.PSU__ENET3__FIFO__ENABLE 0 \
  CONFIG.PSU__ENET3__GRP_MDIO__ENABLE 1 \
  CONFIG.PSU__ENET3__GRP_MDIO__IO {MIO 76 .. 77} \
  CONFIG.PSU__ENET3__PERIPHERAL__ENABLE 1 \
  CONFIG.PSU__ENET3__PERIPHERAL__IO {MIO 64 .. 75} \
  CONFIG.PSU__ENET3__PTP__ENABLE 0 \
  CONFIG.PSU__ENET3__TSU__ENABLE 0 \
  CONFIG.PSU__FPD_SLCR__WDT1__FREQMHZ 100 \
  CONFIG.PSU__FPGA_PL0_ENABLE 1 \
  CONFIG.PSU__GEM3_COHERENCY 0 \
  CONFIG.PSU__GEM3_ROUTE_THROUGH_FPD 0 \
  CONFIG.PSU__GEM__TSU__ENABLE 0 \
  CONFIG.PSU__GPIO0_MIO__PERIPHERAL__ENABLE 0 \
  CONFIG.PSU__GPIO1_MIO__PERIPHERAL__ENABLE 0 \
  CONFIG.PSU__GPIO_EMIO_WIDTH 8 \
  CONFIG.PSU__GPIO_EMIO__PERIPHERAL__ENABLE 1 \
  CONFIG.PSU__GPIO_EMIO__PERIPHERAL__IO 8 \
  CONFIG.PSU__GPU_PP0__POWER__ON 0 \
  CONFIG.PSU__GPU_PP1__POWER__ON 0 \
  CONFIG.PSU__I2C0__PERIPHERAL__ENABLE 1 \
  CONFIG.PSU__I2C0__PERIPHERAL__IO {MIO 30 .. 31} \
  CONFIG.PSU__I2C1__PERIPHERAL__ENABLE 1 \
  CONFIG.PSU__I2C1__PERIPHERAL__IO {MIO 32 .. 33} \
  CONFIG.PSU__IOU_SLCR__IOU_TTC_APB_CLK__TTC0_SEL APB \
  CONFIG.PSU__IOU_SLCR__IOU_TTC_APB_CLK__TTC1_SEL APB \
  CONFIG.PSU__IOU_SLCR__IOU_TTC_APB_CLK__TTC2_SEL APB \
  CONFIG.PSU__IOU_SLCR__IOU_TTC_APB_CLK__TTC3_SEL APB \
  CONFIG.PSU__IOU_SLCR__WDT0__FREQMHZ 100 \
  CONFIG.PSU__IRQ_P2F_USB2_OTG__INT0 0 \
  CONFIG.PSU__IRQ_P2F_USB2_OTG__INT1 0 \
  CONFIG.PSU__LPD_SLCR__CSUPMU__FREQMHZ 100 \
  CONFIG.PSU__MAXIGP0__DATA_WIDTH 64 \
  CONFIG.PSU__M_AXI_GP0__FREQMHZ 10 \
  CONFIG.PSU__NUM_F2P0__INTR__INPUTS 1 \
  CONFIG.PSU__OVERRIDE_HPX_QOS 0 \
  CONFIG.PSU__OVERRIDE__BASIC_CLOCK 0 \
  CONFIG.PSU__PMU__PERIPHERAL__ENABLE 0 \
  CONFIG.PSU__PRESET_APPLIED 0 \
  CONFIG.PSU__PSS_REF_CLK__FREQMHZ 33.3333 \
  CONFIG.PSU__QSPI_COHERENCY 0 \
  CONFIG.PSU__QSPI_ROUTE_THROUGH_FPD 0 \
  CONFIG.PSU__QSPI__GRP_FBCLK__ENABLE 1 \
  CONFIG.PSU__QSPI__GRP_FBCLK__IO {MIO 6} \
  CONFIG.PSU__QSPI__PERIPHERAL__DATA_MODE x4 \
  CONFIG.PSU__QSPI__PERIPHERAL__ENABLE 1 \
  CONFIG.PSU__QSPI__PERIPHERAL__IO {MIO 0 .. 12} \
  CONFIG.PSU__QSPI__PERIPHERAL__MODE {Dual Parallel} \
  CONFIG.PSU__SATA__PERIPHERAL__ENABLE 0 \
  CONFIG.PSU__SD0__CLK_200_SDR_OTAP_DLY 0x3 \
  CONFIG.PSU__SD0__CLK_50_DDR_ITAP_DLY 0x12 \
  CONFIG.PSU__SD0__CLK_50_DDR_OTAP_DLY 0x6 \
  CONFIG.PSU__SD0__CLK_50_SDR_ITAP_DLY 0x15 \
  CONFIG.PSU__SD0__CLK_50_SDR_OTAP_DLY 0x6 \
  CONFIG.PSU__SD0__DATA_TRANSFER_MODE 8Bit \
  CONFIG.PSU__SD0__GRP_POW__ENABLE 1 \
  CONFIG.PSU__SD0__GRP_POW__IO {MIO 23} \
  CONFIG.PSU__SD0__PERIPHERAL__ENABLE 1 \
  CONFIG.PSU__SD0__PERIPHERAL__IO {MIO 13 .. 22} \
  CONFIG.PSU__SD0__RESET__ENABLE 1 \
  CONFIG.PSU__SD0__SLOT_TYPE eMMC \
  CONFIG.PSU__SD1_COHERENCY 0 \
  CONFIG.PSU__SD1_ROUTE_THROUGH_FPD 0 \
  CONFIG.PSU__SD1__CLK_200_SDR_OTAP_DLY 0x3 \
  CONFIG.PSU__SD1__CLK_50_DDR_ITAP_DLY 0x12 \
  CONFIG.PSU__SD1__CLK_50_DDR_OTAP_DLY 0x6 \
  CONFIG.PSU__SD1__CLK_50_SDR_ITAP_DLY 0x15 \
  CONFIG.PSU__SD1__CLK_50_SDR_OTAP_DLY 0x6 \
  CONFIG.PSU__SD1__DATA_TRANSFER_MODE 8Bit \
  CONFIG.PSU__SD1__GRP_POW__ENABLE 1 \
  CONFIG.PSU__SD1__GRP_POW__IO {MIO 43} \
  CONFIG.PSU__SD1__PERIPHERAL__ENABLE 1 \
  CONFIG.PSU__SD1__PERIPHERAL__IO {MIO 39 .. 51} \
  CONFIG.PSU__SD1__RESET__ENABLE 1 \
  CONFIG.PSU__SD1__SLOT_TYPE eMMC \
  CONFIG.PSU__SWDT0__PERIPHERAL__ENABLE 0 \
  CONFIG.PSU__SWDT1__PERIPHERAL__ENABLE 0 \
  CONFIG.PSU__TSU__BUFG_PORT_PAIR 0 \
  CONFIG.PSU__TTC0__CLOCK__ENABLE 0 \
  CONFIG.PSU__TTC0__PERIPHERAL__ENABLE 1 \
  CONFIG.PSU__TTC0__WAVEOUT__ENABLE 0 \
  CONFIG.PSU__TTC1__CLOCK__ENABLE 0 \
  CONFIG.PSU__TTC1__PERIPHERAL__ENABLE 1 \
  CONFIG.PSU__TTC1__WAVEOUT__ENABLE 0 \
  CONFIG.PSU__TTC2__CLOCK__ENABLE 0 \
  CONFIG.PSU__TTC2__PERIPHERAL__ENABLE 1 \
  CONFIG.PSU__TTC2__WAVEOUT__ENABLE 0 \
  CONFIG.PSU__TTC3__CLOCK__ENABLE 0 \
  CONFIG.PSU__TTC3__PERIPHERAL__ENABLE 1 \
  CONFIG.PSU__TTC3__WAVEOUT__ENABLE 0 \
  CONFIG.PSU__UART0__BAUD_RATE 115200 \
  CONFIG.PSU__UART0__MODEM__ENABLE 0 \
  CONFIG.PSU__UART0__PERIPHERAL__ENABLE 1 \
  CONFIG.PSU__UART0__PERIPHERAL__IO {MIO 26 .. 27} \
  CONFIG.PSU__UART1__BAUD_RATE 115200 \
  CONFIG.PSU__UART1__MODEM__ENABLE 0 \
  CONFIG.PSU__UART1__PERIPHERAL__ENABLE 1 \
  CONFIG.PSU__UART1__PERIPHERAL__IO {MIO 28 .. 29} \
  CONFIG.PSU__USB0__PERIPHERAL__ENABLE 0 \
  CONFIG.PSU__USE__IRQ0 1 \
  CONFIG.PSU__USE__M_AXI_GP0 1 \
  CONFIG.PSU__USE__M_AXI_GP1 0 \
  CONFIG.PSU__USE__M_AXI_GP2 0 \
  CONFIG.QSPI_BOARD_INTERFACE custom \
  CONFIG.SATA_BOARD_INTERFACE custom \
  CONFIG.SD0_BOARD_INTERFACE custom \
  CONFIG.SD1_BOARD_INTERFACE custom \
  CONFIG.SPI0_BOARD_INTERFACE custom \
  CONFIG.SPI1_BOARD_INTERFACE custom \
  CONFIG.SUBPRESET1 Custom \
  CONFIG.SUBPRESET2 Custom \
  CONFIG.SWDT0_BOARD_INTERFACE custom \
  CONFIG.SWDT1_BOARD_INTERFACE custom \
  CONFIG.TRACE_BOARD_INTERFACE custom \
  CONFIG.TTC0_BOARD_INTERFACE custom \
  CONFIG.TTC1_BOARD_INTERFACE custom \
  CONFIG.TTC2_BOARD_INTERFACE custom \
  CONFIG.TTC3_BOARD_INTERFACE custom \
  CONFIG.UART0_BOARD_INTERFACE custom \
  CONFIG.UART1_BOARD_INTERFACE custom \
  CONFIG.USB0_BOARD_INTERFACE custom \
  CONFIG.USB1_BOARD_INTERFACE custom \
  CONFIG.preset None \
] [get_bd_cells zynq_ultra_ps_e_0]
# 732 more settings of zynq_ultra_ps_e_0 are not shown: defaults, MIO pin electricals, DDR timing, and values the tool derives
create_bd_cell -type ip -vlnv xilinx.com:ip:proc_sys_reset:5.0 dac_rst1
create_bd_cell -type ip -vlnv xilinx.com:ip:smartconnect:1.0 smartconnect_0
set_property -dict {CONFIG.NUM_CLKS 2 CONFIG.NUM_MI 23 CONFIG.NUM_SI 1} [get_bd_cells smartconnect_0]
create_bd_cell -type ip -vlnv xilinx.com:ip:axi_intc:4.1 axi_intc_0
create_bd_cell -type hier DMA_Ctrl
create_bd_cell -type ip -vlnv xilinx.com:ip:util_ds_buf:2.2 util_ds_buf_0
create_bd_cell -type module -reference pl_sysref_int pl_sysref_int_0
create_bd_cell -type module -reference regs_4_sysref regs_4_sysref_0
create_bd_cell -type ip -vlnv xilinx.com:ip:system_ila:1.1 system_ila_0
set_property -dict [list \
  CONFIG.C_MON_TYPE INTERFACE \
  CONFIG.C_SLOT_0_INTF_TYPE xilinx.com:interface:axis_rtl:1.0 \
] [get_bd_cells system_ila_0]
create_bd_cell -type container -reference aurora_gty_47drto13p aurora_gty_47drto13p_0
set_property -dict [list \
  CONFIG.ACTIVE_SIM_BD aurora_gty_47drto13p.bd \
  CONFIG.ACTIVE_SYNTH_BD aurora_gty_47drto13p.bd \
  CONFIG.ENABLE_DFX 0 \
  CONFIG.LIST_SIM_BD aurora_gty_47drto13p.bd \
  CONFIG.LIST_SYNTH_BD aurora_gty_47drto13p.bd \
  CONFIG.LOCK_PROPAGATE 0 \
] [get_bd_cells aurora_gty_47drto13p_0]
create_bd_cell -type hier hier_rx_x0y1
create_bd_cell -type module -reference sync_pulse_to_level sync_pulse_to_level_1
create_bd_cell -type module -reference timer timer_1
create_bd_cell -type ip -vlnv xilinx.com:ip:util_ds_buf:2.2 util_ds_buf_2
create_bd_cell -type ip -vlnv xilinx.com:ip:util_ds_buf:2.2 util_ds_buf_3
create_bd_cell -type ip -vlnv xilinx.com:ip:axi_gpio:2.0 axi_gpio_pma_rst
set_property -dict {CONFIG.C_ALL_OUTPUTS 1 CONFIG.C_GPIO_WIDTH 1 CONFIG.C_IS_DUAL 0} [get_bd_cells axi_gpio_pma_rst]
create_bd_cell -type ip -vlnv xilinx.com:ip:axi_gpio:2.0 axi_gpio_arstn
set_property -dict {CONFIG.C_ALL_OUTPUTS 1 CONFIG.C_GPIO_WIDTH 1 CONFIG.C_IS_DUAL 0} [get_bd_cells axi_gpio_arstn]
create_bd_cell -type ip -vlnv xilinx.com:ip:xpm_cdc_gen:1.0 xpm_cdc_gen_0
set_property -dict {CONFIG.CDC_TYPE xpm_cdc_sync_rst} [get_bd_cells xpm_cdc_gen_0]
create_bd_cell -type ip -vlnv xilinx.com:ip:xpm_cdc_gen:1.0 xpm_cdc_gen_1
set_property -dict {CONFIG.CDC_TYPE xpm_cdc_sync_rst} [get_bd_cells xpm_cdc_gen_1]
create_bd_cell -type ip -vlnv xilinx.com:ip:util_ds_buf:2.2 util_ds_buf_1
set_property -dict {CONFIG.C_BUF_TYPE OBUFDS} [get_bd_cells util_ds_buf_1]
create_bd_cell -type hier hier_mts
create_bd_cell -type hier hier_rx_x0y2
create_bd_cell -type hier hier_rx_x0y3
create_bd_cell -type hier hier_rx_x0y4
create_bd_cell -type ip -vlnv xilinx.com:ip:axi_gpio:2.0 axi_delay
set_property -dict {CONFIG.C_ALL_OUTPUTS 1 CONFIG.C_DOUT_DEFAULT 0x00000200} [get_bd_cells axi_delay]
create_bd_cell -type module -reference system_reg_map system_reg_map
set_property -dict {CONFIG.BUILD_VERSION 0} [get_bd_cells system_reg_map]
create_bd_cell -type ip -vlnv xilinx.com:ip:vio:3.0 vio_ext_inputs
set_property -dict [list \
  CONFIG.C_NUM_PROBE_IN 0 \
  CONFIG.C_NUM_PROBE_OUT 32 \
  CONFIG.C_PROBE_OUT0_WIDTH 3 \
  CONFIG.C_PROBE_OUT10_WIDTH 16 \
  CONFIG.C_PROBE_OUT11_WIDTH 9 \
  CONFIG.C_PROBE_OUT12_WIDTH 3 \
  CONFIG.C_PROBE_OUT13_WIDTH 9 \
  CONFIG.C_PROBE_OUT14_WIDTH 16 \
  CONFIG.C_PROBE_OUT15_WIDTH 9 \
  CONFIG.C_PROBE_OUT16_WIDTH 3 \
  CONFIG.C_PROBE_OUT17_WIDTH 9 \
  CONFIG.C_PROBE_OUT18_WIDTH 16 \
  CONFIG.C_PROBE_OUT19_WIDTH 9 \
  CONFIG.C_PROBE_OUT1_WIDTH 9 \
  CONFIG.C_PROBE_OUT20_WIDTH 3 \
  CONFIG.C_PROBE_OUT21_WIDTH 9 \
  CONFIG.C_PROBE_OUT22_WIDTH 16 \
  CONFIG.C_PROBE_OUT23_WIDTH 9 \
  CONFIG.C_PROBE_OUT24_WIDTH 3 \
  CONFIG.C_PROBE_OUT25_WIDTH 9 \
  CONFIG.C_PROBE_OUT26_WIDTH 16 \
  CONFIG.C_PROBE_OUT27_WIDTH 9 \
  CONFIG.C_PROBE_OUT28_WIDTH 3 \
  CONFIG.C_PROBE_OUT29_WIDTH 9 \
  CONFIG.C_PROBE_OUT2_WIDTH 16 \
  CONFIG.C_PROBE_OUT30_WIDTH 16 \
  CONFIG.C_PROBE_OUT31_WIDTH 9 \
  CONFIG.C_PROBE_OUT3_WIDTH 9 \
  CONFIG.C_PROBE_OUT4_WIDTH 3 \
  CONFIG.C_PROBE_OUT5_WIDTH 9 \
  CONFIG.C_PROBE_OUT6_WIDTH 16 \
  CONFIG.C_PROBE_OUT7_WIDTH 9 \
  CONFIG.C_PROBE_OUT8_WIDTH 3 \
  CONFIG.C_PROBE_OUT9_WIDTH 9 \
] [get_bd_cells vio_ext_inputs]
create_bd_cell -type container -reference cal_plus_gain_control cal_plus_gain_control_ch1
set_property -dict [list \
  CONFIG.ACTIVE_SIM_BD cal_plus_gain_control.bd \
  CONFIG.ACTIVE_SYNTH_BD cal_plus_gain_control.bd \
  CONFIG.ENABLE_DFX 0 \
  CONFIG.LIST_SIM_BD cal_plus_gain_control.bd \
  CONFIG.LIST_SYNTH_BD cal_plus_gain_control.bd \
  CONFIG.LOCK_PROPAGATE 0 \
] [get_bd_cells cal_plus_gain_control_ch1]
create_bd_cell -type module -reference axi_stream_combininput rfdc_iq_combine_ch1
create_bd_cell -type container -reference cal_plus_gain_control cal_plus_gain_control_ch2
set_property -dict [list \
  CONFIG.ACTIVE_SIM_BD cal_plus_gain_control.bd \
  CONFIG.ACTIVE_SYNTH_BD cal_plus_gain_control.bd \
  CONFIG.ENABLE_DFX 0 \
  CONFIG.LIST_SIM_BD cal_plus_gain_control.bd \
  CONFIG.LIST_SYNTH_BD cal_plus_gain_control.bd \
  CONFIG.LOCK_PROPAGATE 0 \
] [get_bd_cells cal_plus_gain_control_ch2]
create_bd_cell -type module -reference axi_stream_combininput rfdc_iq_combine_ch2
create_bd_cell -type container -reference cal_plus_gain_control cal_plus_gain_control_ch3
set_property -dict [list \
  CONFIG.ACTIVE_SIM_BD cal_plus_gain_control.bd \
  CONFIG.ACTIVE_SYNTH_BD cal_plus_gain_control.bd \
  CONFIG.ENABLE_DFX 0 \
  CONFIG.LIST_SIM_BD cal_plus_gain_control.bd \
  CONFIG.LIST_SYNTH_BD cal_plus_gain_control.bd \
  CONFIG.LOCK_PROPAGATE 0 \
] [get_bd_cells cal_plus_gain_control_ch3]
create_bd_cell -type module -reference axi_stream_combininput rfdc_iq_combine_ch3
create_bd_cell -type container -reference cal_plus_gain_control cal_plus_gain_control_ch4
set_property -dict [list \
  CONFIG.ACTIVE_SIM_BD cal_plus_gain_control.bd \
  CONFIG.ACTIVE_SYNTH_BD cal_plus_gain_control.bd \
  CONFIG.ENABLE_DFX 0 \
  CONFIG.LIST_SIM_BD cal_plus_gain_control.bd \
  CONFIG.LIST_SYNTH_BD cal_plus_gain_control.bd \
  CONFIG.LOCK_PROPAGATE 0 \
] [get_bd_cells cal_plus_gain_control_ch4]
create_bd_cell -type module -reference axi_stream_combininput rfdc_iq_combine_ch4
create_bd_cell -type container -reference cal_plus_gain_control cal_plus_gain_control_ch5
set_property -dict [list \
  CONFIG.ACTIVE_SIM_BD cal_plus_gain_control.bd \
  CONFIG.ACTIVE_SYNTH_BD cal_plus_gain_control.bd \
  CONFIG.ENABLE_DFX 0 \
  CONFIG.LIST_SIM_BD cal_plus_gain_control.bd \
  CONFIG.LIST_SYNTH_BD cal_plus_gain_control.bd \
  CONFIG.LOCK_PROPAGATE 0 \
] [get_bd_cells cal_plus_gain_control_ch5]
create_bd_cell -type module -reference axi_stream_combininput rfdc_iq_combine_ch5
create_bd_cell -type container -reference cal_plus_gain_control cal_plus_gain_control_ch6
set_property -dict [list \
  CONFIG.ACTIVE_SIM_BD cal_plus_gain_control.bd \
  CONFIG.ACTIVE_SYNTH_BD cal_plus_gain_control.bd \
  CONFIG.ENABLE_DFX 0 \
  CONFIG.LIST_SIM_BD cal_plus_gain_control.bd \
  CONFIG.LIST_SYNTH_BD cal_plus_gain_control.bd \
  CONFIG.LOCK_PROPAGATE 0 \
] [get_bd_cells cal_plus_gain_control_ch6]
create_bd_cell -type module -reference axi_stream_combininput rfdc_iq_combine_ch6
create_bd_cell -type container -reference cal_plus_gain_control cal_plus_gain_control_ch7
set_property -dict [list \
  CONFIG.ACTIVE_SIM_BD cal_plus_gain_control.bd \
  CONFIG.ACTIVE_SYNTH_BD cal_plus_gain_control.bd \
  CONFIG.ENABLE_DFX 0 \
  CONFIG.LIST_SIM_BD cal_plus_gain_control.bd \
  CONFIG.LIST_SYNTH_BD cal_plus_gain_control.bd \
  CONFIG.LOCK_PROPAGATE 0 \
] [get_bd_cells cal_plus_gain_control_ch7]
create_bd_cell -type module -reference axi_stream_combininput rfdc_iq_combine_ch7
create_bd_cell -type container -reference cal_plus_gain_control cal_plus_gain_control_ch8
set_property -dict [list \
  CONFIG.ACTIVE_SIM_BD cal_plus_gain_control.bd \
  CONFIG.ACTIVE_SYNTH_BD cal_plus_gain_control.bd \
  CONFIG.ENABLE_DFX 0 \
  CONFIG.LIST_SIM_BD cal_plus_gain_control.bd \
  CONFIG.LIST_SYNTH_BD cal_plus_gain_control.bd \
  CONFIG.LOCK_PROPAGATE 0 \
] [get_bd_cells cal_plus_gain_control_ch8]
create_bd_cell -type module -reference axi_stream_combininput rfdc_iq_combine_ch8

# ---- hierarchy /DMA_Ctrl ----
current_bd_instance /DMA_Ctrl
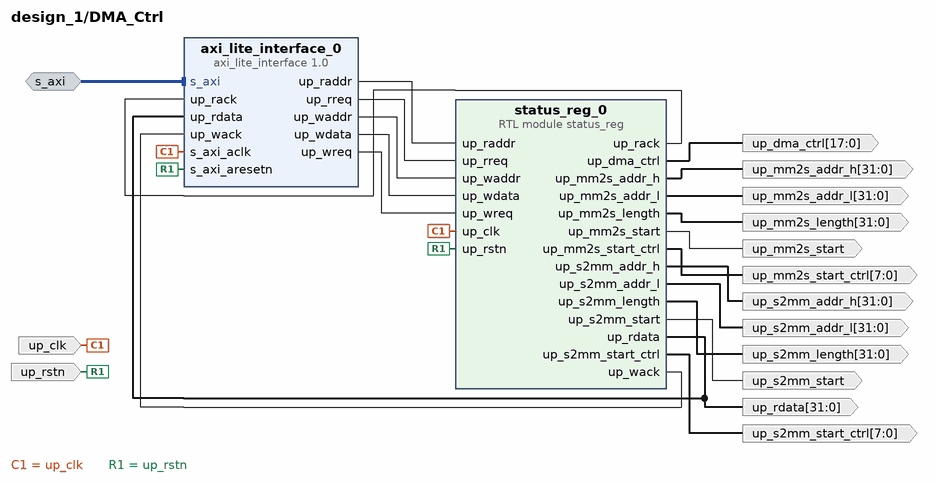
[diagram p7: block diagram inside /DMA_Ctrl]
create_bd_intf_pin -mode Slave -vlnv xilinx.com:interface:aximm_rtl:1.0 s_axi
create_bd_pin -dir I -type rst up_rstn
create_bd_pin -dir I -type clk up_clk
create_bd_pin -dir O -from 31 -to 0 up_rdata
create_bd_pin -dir O -from 17 -to 0 up_dma_ctrl
create_bd_pin -dir O -from 31 -to 0 up_mm2s_addr_h
create_bd_pin -dir O -from 31 -to 0 up_mm2s_addr_l
create_bd_pin -dir O -from 31 -to 0 up_mm2s_length
create_bd_pin -dir O up_mm2s_start
create_bd_pin -dir O -from 7 -to 0 up_mm2s_start_ctrl
create_bd_pin -dir O -from 31 -to 0 up_s2mm_addr_h
create_bd_pin -dir O -from 31 -to 0 up_s2mm_addr_l
create_bd_pin -dir O -from 31 -to 0 up_s2mm_length
create_bd_pin -dir O up_s2mm_start
create_bd_pin -dir O -from 7 -to 0 up_s2mm_start_ctrl

create_bd_cell -type ip -vlnv xilinx.com:user:axi_lite_interface:1.0 axi_lite_interface_0
create_bd_cell -type module -reference status_reg status_reg_0

# ---- hierarchy /hier_rx_x0y1 ----
current_bd_instance /hier_rx_x0y1
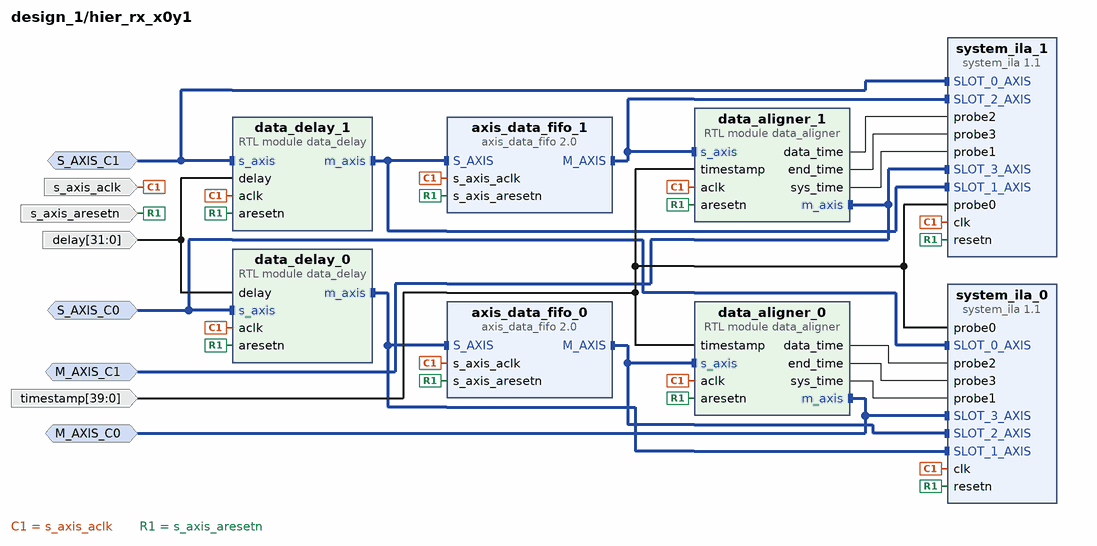
[diagram p8: block diagram inside /hier_rx_x0y1]
create_bd_intf_pin -mode Monitor -vlnv xilinx.com:interface:axis_rtl:1.0 M_AXIS_C1
create_bd_intf_pin -mode Slave -vlnv xilinx.com:interface:axis_rtl:1.0 S_AXIS_C1
create_bd_intf_pin -mode Slave -vlnv xilinx.com:interface:axis_rtl:1.0 S_AXIS_C0
create_bd_intf_pin -mode Monitor -vlnv xilinx.com:interface:axis_rtl:1.0 M_AXIS_C0
create_bd_pin -dir I -type rst s_axis_aresetn
create_bd_pin -dir I -from 31 -to 0 delay
create_bd_pin -dir I -from 39 -to 0 timestamp
create_bd_pin -dir I -type clk s_axis_aclk

create_bd_cell -type module -reference data_aligner data_aligner_0
create_bd_cell -type ip -vlnv xilinx.com:ip:axis_data_fifo:2.0 axis_data_fifo_0
set_property -dict {CONFIG.FIFO_DEPTH 1024 CONFIG.TUSER_WIDTH 64} [get_bd_cells axis_data_fifo_0]
create_bd_cell -type module -reference data_delay data_delay_0
create_bd_cell -type module -reference data_delay data_delay_1
create_bd_cell -type ip -vlnv xilinx.com:ip:system_ila:1.1 system_ila_0
set_property -dict [list \
  CONFIG.C_MON_TYPE MIX \
  CONFIG.C_NUM_MONITOR_SLOTS 4 \
  CONFIG.C_NUM_OF_PROBES 4 \
  CONFIG.C_SLOT 3 \
  CONFIG.C_SLOT_0_INTF_TYPE xilinx.com:interface:axis_rtl:1.0 \
  CONFIG.C_SLOT_1_INTF_TYPE xilinx.com:interface:axis_rtl:1.0 \
  CONFIG.C_SLOT_2_INTF_TYPE xilinx.com:interface:axis_rtl:1.0 \
  CONFIG.C_SLOT_3_INTF_TYPE xilinx.com:interface:axis_rtl:1.0 \
] [get_bd_cells system_ila_0]
create_bd_cell -type ip -vlnv xilinx.com:ip:axis_data_fifo:2.0 axis_data_fifo_1
set_property -dict {CONFIG.FIFO_DEPTH 1024 CONFIG.TUSER_WIDTH 64} [get_bd_cells axis_data_fifo_1]
create_bd_cell -type module -reference data_aligner data_aligner_1
create_bd_cell -type ip -vlnv xilinx.com:ip:system_ila:1.1 system_ila_1
set_property -dict [list \
  CONFIG.C_MON_TYPE MIX \
  CONFIG.C_NUM_MONITOR_SLOTS 4 \
  CONFIG.C_NUM_OF_PROBES 4 \
  CONFIG.C_SLOT 3 \
  CONFIG.C_SLOT_0_INTF_TYPE xilinx.com:interface:axis_rtl:1.0 \
  CONFIG.C_SLOT_1_INTF_TYPE xilinx.com:interface:axis_rtl:1.0 \
  CONFIG.C_SLOT_2_INTF_TYPE xilinx.com:interface:axis_rtl:1.0 \
  CONFIG.C_SLOT_3_INTF_TYPE xilinx.com:interface:axis_rtl:1.0 \
] [get_bd_cells system_ila_1]

# ---- hierarchy /hier_mts ----
current_bd_instance /hier_mts
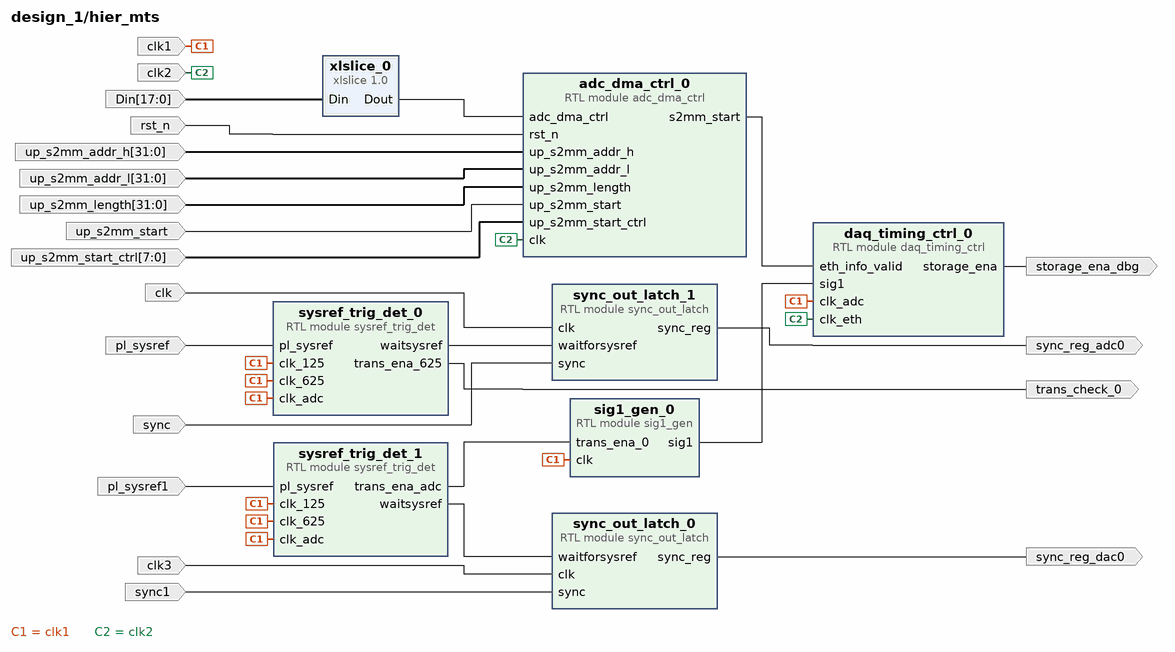
[diagram p9: block diagram inside /hier_mts]
create_bd_pin -dir I -type clk clk
create_bd_pin -dir I sync
create_bd_pin -dir O sync_reg_adc0
create_bd_pin -dir I -type clk clk1
create_bd_pin -dir I -type clk clk2
create_bd_pin -dir O storage_ena_dbg
create_bd_pin -dir I pl_sysref
create_bd_pin -dir O trans_check_0
create_bd_pin -dir I -type clk clk3
create_bd_pin -dir I sync1
create_bd_pin -dir O sync_reg_dac0
create_bd_pin -dir I -type rst rst_n
create_bd_pin -dir I -from 31 -to 0 up_s2mm_addr_l
create_bd_pin -dir I -from 31 -to 0 up_s2mm_addr_h
create_bd_pin -dir I -from 31 -to 0 up_s2mm_length
create_bd_pin -dir I -from 7 -to 0 up_s2mm_start_ctrl
create_bd_pin -dir I up_s2mm_start
create_bd_pin -dir I pl_sysref1
create_bd_pin -dir I -from 17 -to 0 Din

create_bd_cell -type module -reference sync_out_latch sync_out_latch_1
create_bd_cell -type module -reference daq_timing_ctrl daq_timing_ctrl_0
create_bd_cell -type module -reference sig1_gen sig1_gen_0
create_bd_cell -type module -reference sysref_trig_det sysref_trig_det_0
create_bd_cell -type module -reference sync_out_latch sync_out_latch_0
create_bd_cell -type module -reference adc_dma_ctrl adc_dma_ctrl_0
create_bd_cell -type module -reference sysref_trig_det sysref_trig_det_1
create_bd_cell -type ip -vlnv xilinx.com:ip:xlslice:1.0 xlslice_0
set_property -dict {CONFIG.DIN_FROM 17 CONFIG.DIN_TO 9 CONFIG.DIN_WIDTH 18 CONFIG.DOUT_WIDTH 9} [get_bd_cells xlslice_0]

# ---- hierarchy /hier_rx_x0y2 ----
current_bd_instance /hier_rx_x0y2
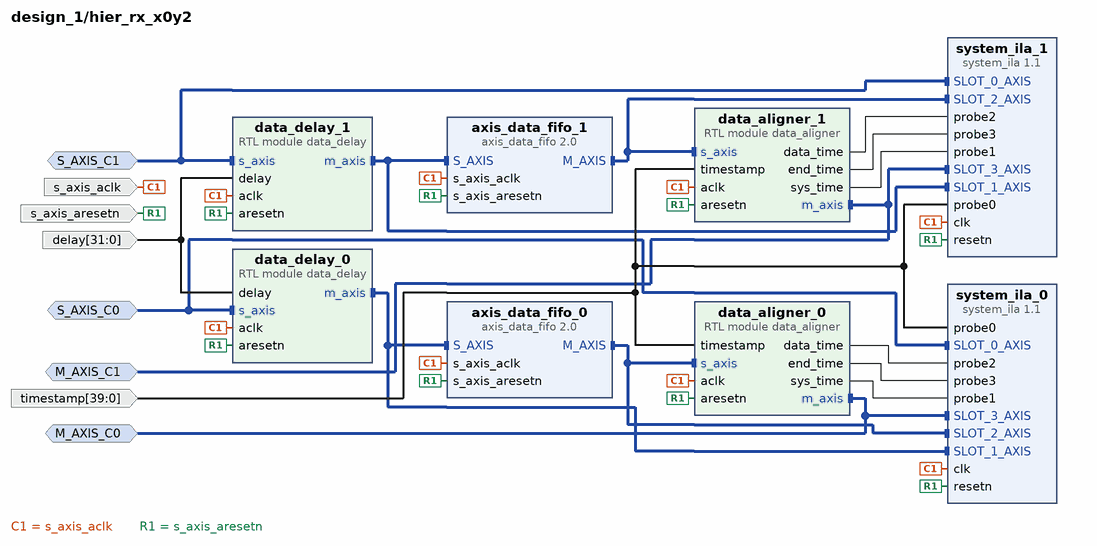
[diagram p10: block diagram inside /hier_rx_x0y2]
create_bd_intf_pin -mode Monitor -vlnv xilinx.com:interface:axis_rtl:1.0 M_AXIS_C1
create_bd_intf_pin -mode Slave -vlnv xilinx.com:interface:axis_rtl:1.0 S_AXIS_C1
create_bd_intf_pin -mode Slave -vlnv xilinx.com:interface:axis_rtl:1.0 S_AXIS_C0
create_bd_intf_pin -mode Monitor -vlnv xilinx.com:interface:axis_rtl:1.0 M_AXIS_C0
create_bd_pin -dir I -type rst s_axis_aresetn
create_bd_pin -dir I -from 31 -to 0 delay
create_bd_pin -dir I -from 39 -to 0 timestamp
create_bd_pin -dir I -type clk s_axis_aclk

create_bd_cell -type module -reference data_aligner data_aligner_0
create_bd_cell -type ip -vlnv xilinx.com:ip:axis_data_fifo:2.0 axis_data_fifo_0
set_property -dict {CONFIG.FIFO_DEPTH 1024 CONFIG.TUSER_WIDTH 64} [get_bd_cells axis_data_fifo_0]
create_bd_cell -type module -reference data_delay data_delay_0
create_bd_cell -type module -reference data_delay data_delay_1
create_bd_cell -type ip -vlnv xilinx.com:ip:system_ila:1.1 system_ila_0
set_property -dict [list \
  CONFIG.C_MON_TYPE MIX \
  CONFIG.C_NUM_MONITOR_SLOTS 4 \
  CONFIG.C_NUM_OF_PROBES 4 \
  CONFIG.C_SLOT 3 \
  CONFIG.C_SLOT_0_INTF_TYPE xilinx.com:interface:axis_rtl:1.0 \
  CONFIG.C_SLOT_1_INTF_TYPE xilinx.com:interface:axis_rtl:1.0 \
  CONFIG.C_SLOT_2_INTF_TYPE xilinx.com:interface:axis_rtl:1.0 \
  CONFIG.C_SLOT_3_INTF_TYPE xilinx.com:interface:axis_rtl:1.0 \
] [get_bd_cells system_ila_0]
create_bd_cell -type ip -vlnv xilinx.com:ip:axis_data_fifo:2.0 axis_data_fifo_1
set_property -dict {CONFIG.FIFO_DEPTH 1024 CONFIG.TUSER_WIDTH 64} [get_bd_cells axis_data_fifo_1]
create_bd_cell -type module -reference data_aligner data_aligner_1
create_bd_cell -type ip -vlnv xilinx.com:ip:system_ila:1.1 system_ila_1
set_property -dict [list \
  CONFIG.C_MON_TYPE MIX \
  CONFIG.C_NUM_MONITOR_SLOTS 4 \
  CONFIG.C_NUM_OF_PROBES 4 \
  CONFIG.C_SLOT 3 \
  CONFIG.C_SLOT_0_INTF_TYPE xilinx.com:interface:axis_rtl:1.0 \
  CONFIG.C_SLOT_1_INTF_TYPE xilinx.com:interface:axis_rtl:1.0 \
  CONFIG.C_SLOT_2_INTF_TYPE xilinx.com:interface:axis_rtl:1.0 \
  CONFIG.C_SLOT_3_INTF_TYPE xilinx.com:interface:axis_rtl:1.0 \
] [get_bd_cells system_ila_1]

# ---- hierarchy /hier_rx_x0y3 ----
current_bd_instance /hier_rx_x0y3
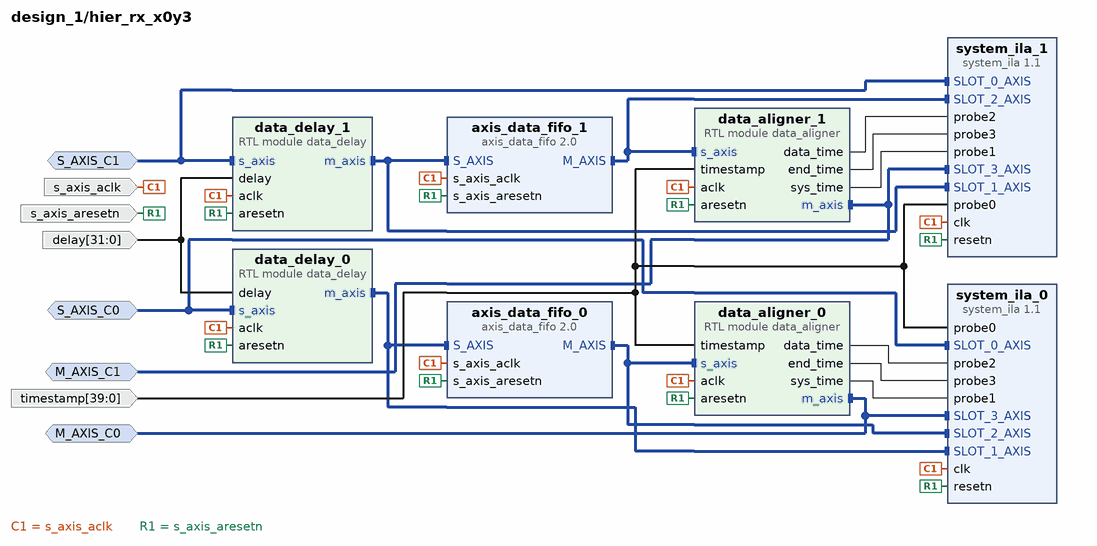
[diagram p11: block diagram inside /hier_rx_x0y3]
create_bd_intf_pin -mode Monitor -vlnv xilinx.com:interface:axis_rtl:1.0 M_AXIS_C1
create_bd_intf_pin -mode Slave -vlnv xilinx.com:interface:axis_rtl:1.0 S_AXIS_C1
create_bd_intf_pin -mode Slave -vlnv xilinx.com:interface:axis_rtl:1.0 S_AXIS_C0
create_bd_intf_pin -mode Monitor -vlnv xilinx.com:interface:axis_rtl:1.0 M_AXIS_C0
create_bd_pin -dir I -type rst s_axis_aresetn
create_bd_pin -dir I -from 31 -to 0 delay
create_bd_pin -dir I -from 39 -to 0 timestamp
create_bd_pin -dir I -type clk s_axis_aclk

create_bd_cell -type module -reference data_aligner data_aligner_0
create_bd_cell -type ip -vlnv xilinx.com:ip:axis_data_fifo:2.0 axis_data_fifo_0
set_property -dict {CONFIG.FIFO_DEPTH 1024 CONFIG.TUSER_WIDTH 64} [get_bd_cells axis_data_fifo_0]
create_bd_cell -type module -reference data_delay data_delay_0
create_bd_cell -type module -reference data_delay data_delay_1
create_bd_cell -type ip -vlnv xilinx.com:ip:system_ila:1.1 system_ila_0
set_property -dict [list \
  CONFIG.C_MON_TYPE MIX \
  CONFIG.C_NUM_MONITOR_SLOTS 4 \
  CONFIG.C_NUM_OF_PROBES 4 \
  CONFIG.C_SLOT 3 \
  CONFIG.C_SLOT_0_INTF_TYPE xilinx.com:interface:axis_rtl:1.0 \
  CONFIG.C_SLOT_1_INTF_TYPE xilinx.com:interface:axis_rtl:1.0 \
  CONFIG.C_SLOT_2_INTF_TYPE xilinx.com:interface:axis_rtl:1.0 \
  CONFIG.C_SLOT_3_INTF_TYPE xilinx.com:interface:axis_rtl:1.0 \
] [get_bd_cells system_ila_0]
create_bd_cell -type ip -vlnv xilinx.com:ip:axis_data_fifo:2.0 axis_data_fifo_1
set_property -dict {CONFIG.FIFO_DEPTH 1024 CONFIG.TUSER_WIDTH 64} [get_bd_cells axis_data_fifo_1]
create_bd_cell -type module -reference data_aligner data_aligner_1
create_bd_cell -type ip -vlnv xilinx.com:ip:system_ila:1.1 system_ila_1
set_property -dict [list \
  CONFIG.C_MON_TYPE MIX \
  CONFIG.C_NUM_MONITOR_SLOTS 4 \
  CONFIG.C_NUM_OF_PROBES 4 \
  CONFIG.C_SLOT 3 \
  CONFIG.C_SLOT_0_INTF_TYPE xilinx.com:interface:axis_rtl:1.0 \
  CONFIG.C_SLOT_1_INTF_TYPE xilinx.com:interface:axis_rtl:1.0 \
  CONFIG.C_SLOT_2_INTF_TYPE xilinx.com:interface:axis_rtl:1.0 \
  CONFIG.C_SLOT_3_INTF_TYPE xilinx.com:interface:axis_rtl:1.0 \
] [get_bd_cells system_ila_1]

# ---- hierarchy /hier_rx_x0y4 ----
current_bd_instance /hier_rx_x0y4
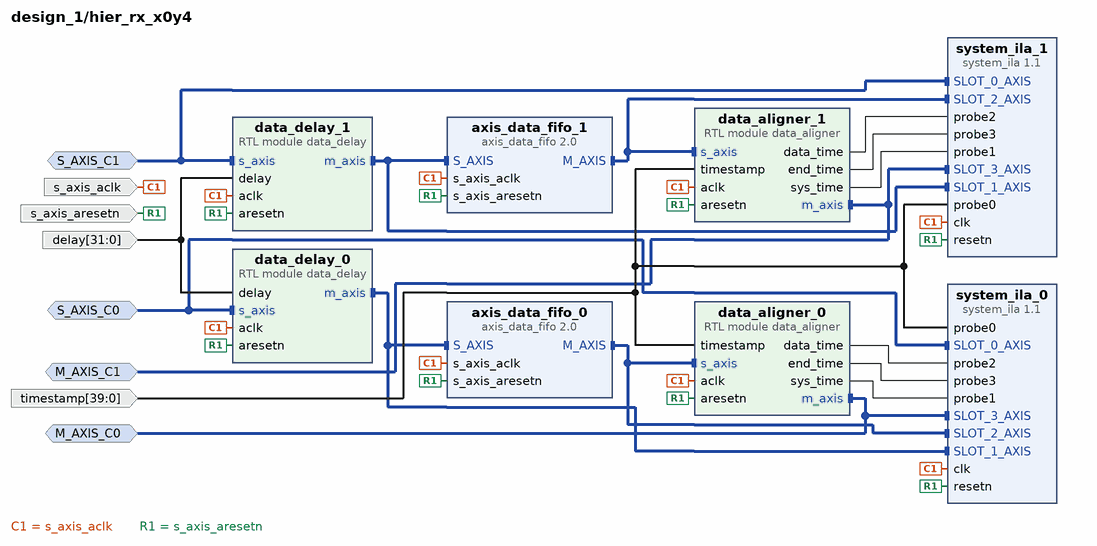
[diagram p12: block diagram inside /hier_rx_x0y4]
create_bd_intf_pin -mode Monitor -vlnv xilinx.com:interface:axis_rtl:1.0 M_AXIS_C1
create_bd_intf_pin -mode Slave -vlnv xilinx.com:interface:axis_rtl:1.0 S_AXIS_C1
create_bd_intf_pin -mode Slave -vlnv xilinx.com:interface:axis_rtl:1.0 S_AXIS_C0
create_bd_intf_pin -mode Monitor -vlnv xilinx.com:interface:axis_rtl:1.0 M_AXIS_C0
create_bd_pin -dir I -type rst s_axis_aresetn
create_bd_pin -dir I -from 31 -to 0 delay
create_bd_pin -dir I -from 39 -to 0 timestamp
create_bd_pin -dir I -type clk s_axis_aclk

create_bd_cell -type module -reference data_aligner data_aligner_0
create_bd_cell -type ip -vlnv xilinx.com:ip:axis_data_fifo:2.0 axis_data_fifo_0
set_property -dict {CONFIG.FIFO_DEPTH 1024 CONFIG.TUSER_WIDTH 64} [get_bd_cells axis_data_fifo_0]
create_bd_cell -type module -reference data_delay data_delay_0
create_bd_cell -type module -reference data_delay data_delay_1
create_bd_cell -type ip -vlnv xilinx.com:ip:system_ila:1.1 system_ila_0
set_property -dict [list \
  CONFIG.C_MON_TYPE MIX \
  CONFIG.C_NUM_MONITOR_SLOTS 4 \
  CONFIG.C_NUM_OF_PROBES 4 \
  CONFIG.C_SLOT 3 \
  CONFIG.C_SLOT_0_INTF_TYPE xilinx.com:interface:axis_rtl:1.0 \
  CONFIG.C_SLOT_1_INTF_TYPE xilinx.com:interface:axis_rtl:1.0 \
  CONFIG.C_SLOT_2_INTF_TYPE xilinx.com:interface:axis_rtl:1.0 \
  CONFIG.C_SLOT_3_INTF_TYPE xilinx.com:interface:axis_rtl:1.0 \
] [get_bd_cells system_ila_0]
create_bd_cell -type ip -vlnv xilinx.com:ip:axis_data_fifo:2.0 axis_data_fifo_1
set_property -dict {CONFIG.FIFO_DEPTH 1024 CONFIG.TUSER_WIDTH 64} [get_bd_cells axis_data_fifo_1]
create_bd_cell -type module -reference data_aligner data_aligner_1
create_bd_cell -type ip -vlnv xilinx.com:ip:system_ila:1.1 system_ila_1
set_property -dict [list \
  CONFIG.C_MON_TYPE MIX \
  CONFIG.C_NUM_MONITOR_SLOTS 4 \
  CONFIG.C_NUM_OF_PROBES 4 \
  CONFIG.C_SLOT 3 \
  CONFIG.C_SLOT_0_INTF_TYPE xilinx.com:interface:axis_rtl:1.0 \
  CONFIG.C_SLOT_1_INTF_TYPE xilinx.com:interface:axis_rtl:1.0 \
  CONFIG.C_SLOT_2_INTF_TYPE xilinx.com:interface:axis_rtl:1.0 \
  CONFIG.C_SLOT_3_INTF_TYPE xilinx.com:interface:axis_rtl:1.0 \
] [get_bd_cells system_ila_1]
